# Altium project ESP32_P4_ESP32_C5.PrjPcb
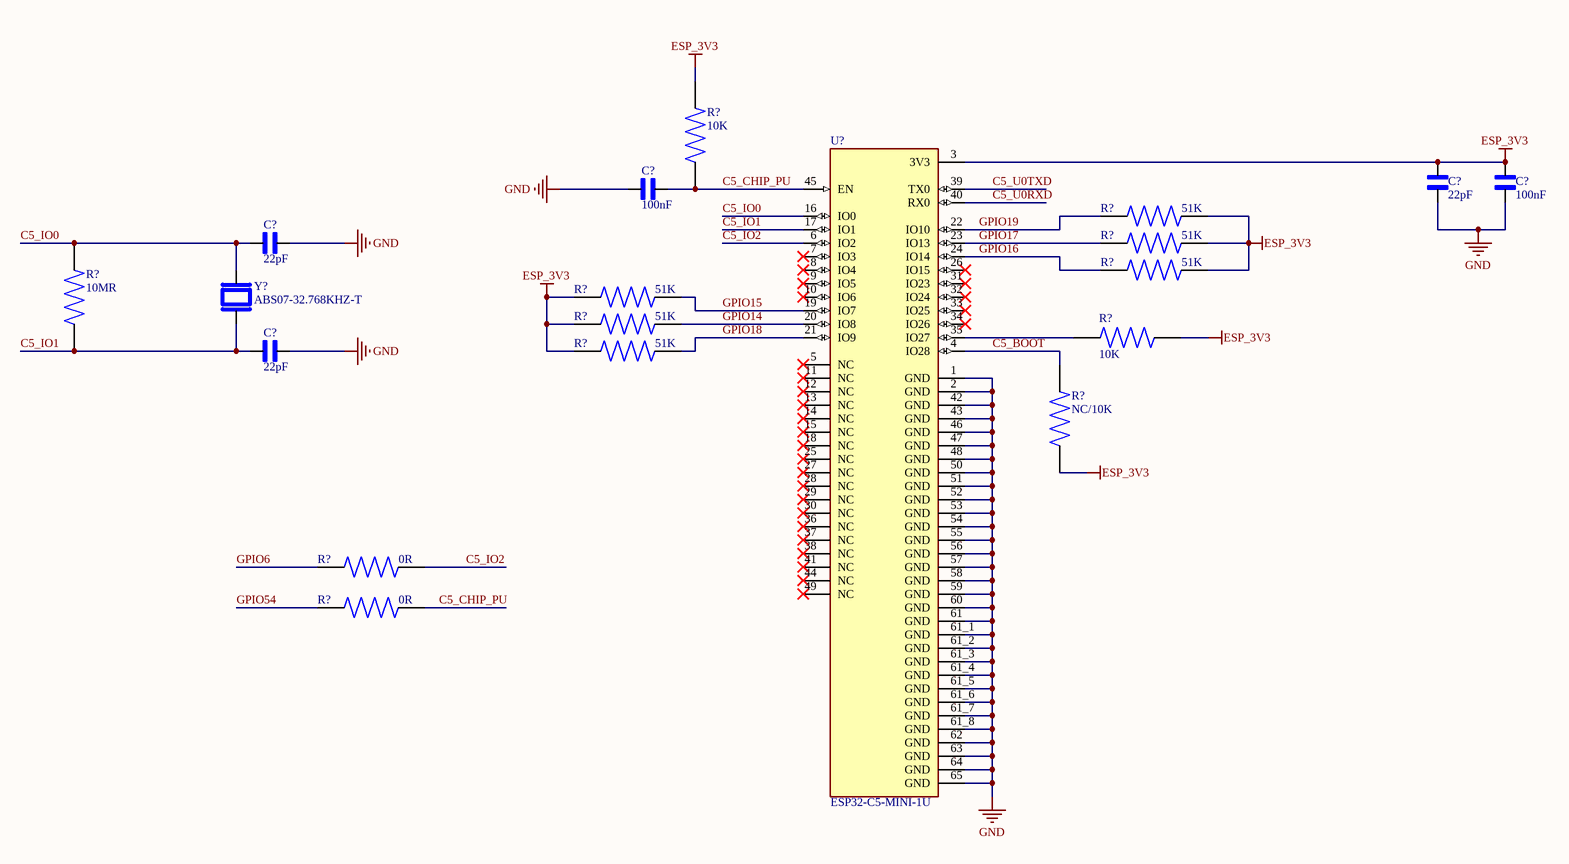
[diagram p0: esp32c5.SchDoc]
7 sheets, 178 parts. Net scope: global (net labels, ports and power ports of the same name join across sheets).
Sheets:
  esp32c5.SchDoc
  MSD_CARD.SchDoc
  type_C_A_power.SchDoc
  usb_uart_ESP32P4.SchDoc
  ESP32_P4.SchDoc
  connect.SchDoc
  usb_uart_esp32c5.SchDoc

## Sheet esp32c5.SchDoc
size B; SheetNumber: 1; SheetTotal: 5

### Parts
(Parts that share a designator on the sheet are numbered #1, #2 ... from top to bottom, then left to right.)
C?#1  100nF  [CAPC1005X61N]
C?#2  22pF  [CAPC1005X61N]
C?#3  100nF  [CAPC1005X61N]
C?#4  22pF  [CAPC1005X61N]
C?#5  22pF  [CAPC1005X61N]
R?#1  10K  [RES_ERJU02F5102X]
R?#2  51K  [RES_ERJU02F5102X]
R?#3  51K  [RES_ERJU02F5102X]
R?#4  51K  [RES_ERJU02F5102X]
R?#5  10MR  [RES_ERJU02F5102X]
R?#6  51K  [RES_ERJU02F5102X]
R?#7  51K  [RES_ERJU02F5102X]
R?#8  10K  [RES_ERJU02F5102X]
R?#9  51K  [RES_ERJU02F5102X]
R?#10  NC/10K  [RES_ERJU02F5102X]
R?#11  0R  [RES_ERJU02F5102X]
R?#12  0R  [RES_ERJU02F5102X]
U?#1  ESP32-C5-MINI-1U  [ESP32-C5-MINI-1U]
Y?#1  ABS07-32.768KHZ-T  [XTAL_ABS07-32.768KHZ-T]

### Nets
ESP_3V3: C?#2.2 C?#3.2 R?#1.1 R?#2.2 R?#3.2 R?#4.2 R?#6.1 R?#7.1 R?#8.1 R?#9.1 R?#10.2 U?#1.3(3V3)
GND: C?#1.2 C?#2.1 C?#3.1 C?#4.2 C?#5.2 U?#1.1(GND) U?#1.2(GND) U?#1.42(GND) U?#1.43(GND) U?#1.46(GND) U?#1.47(GND) U?#1.48(GND) U?#1.50(GND) U?#1.51(GND) U?#1.52(GND) U?#1.53(GND) U?#1.54(GND) U?#1.55(GND) U?#1.56(GND) U?#1.57(GND) U?#1.58(GND) U?#1.59(GND) U?#1.60(GND) U?#1.61(GND) U?#1.61_1(GND) U?#1.61_2(GND) U?#1.61_3(GND) U?#1.61_4(GND) U?#1.61_5(GND) U?#1.61_6(GND) U?#1.61_7(GND) U?#1.61_8(GND) U?#1.62(GND) U?#1.63(GND) U?#1.64(GND) U?#1.65(GND)
C5_BOOT: R?#10.1 U?#1.4(IO28)
C5_CHIP_PU: C?#1.1 R?#1.2 R?#12.2 U?#1.45(EN)
C5_IO0: C?#4.1 R?#5.2 U?#1.16(IO0) Y?#1.2
C5_IO1: C?#5.1 R?#5.1 U?#1.17(IO1) Y?#1.1
C5_IO2: R?#11.2 U?#1.6(IO2)
C5_U0RXD: U?#1.40(RX0)
C5_U0TXD: U?#1.39(TX0)
GPIO6: R?#11.1
GPIO14: R?#7.2 U?#1.20(IO8)
GPIO15: R?#6.2 U?#1.19(IO7)
GPIO16: R?#4.1 U?#1.24(IO14)
GPIO17: R?#3.1 U?#1.23(IO13)
GPIO18: R?#9.2 U?#1.21(IO9)
GPIO19: R?#2.1 U?#1.22(IO10)
GPIO54: R?#12.1
NetR?#8_2: R?#8.2 U?#1.35(IO27)

Not connected (* = marked no-connect by the designer): U?#1 5(NC)* 7(IO3)* 8(IO4)* 9(IO5)* 10(IO6)* 11(NC)* 12(NC)* 13(NC)* 14(NC)* 15(NC)* 18(NC)* 25(NC)* 26(IO15)* 27(NC)* 28(NC)* 29(NC)* 30(NC)* 31(IO23)* 32(IO24)* 33(IO25)* 34(IO26)* 36(NC)* 37(NC)* 38(NC)* 41(NC)* 44(NC)* 49(NC)*

### Library data of the parts
C?#1-C?#5 = cap_0402_VJ0402D100MXCAP: cap 0402; MF: Vishay Vitramon; SnapEDA_Link: https://www.snapeda.com/parts/VJ0402D100MXCAP/Vishay/view-part/?ref=snap; Package: 1005 Vishay Vitramon; Value: *; MP: VJ0402D100MXCAP; Check_prices: https://www.snapeda.com/parts/VJ0402D100MXCAP/Vishay/view-part/?ref=eda
R?#1-R?#12 = res_0402_ERJU02F5102X: Availability: Unavailable; MP: ERJU02F5102X; Price: None; Package: None; Value: *
U?#1 = ESP32-C5-MINI-1U: Compact Wi-Fi 6 and Bluetooth 5.0 LE wireless module based on the ESP32-C5 SoC, featuring a 32-bit RISC-V single-core processor up to 240 MHz, 4 MB SPI flash, 2.4 GHz and 5 GHz dual-band Wi-Fi, IEEE 802.15.4 (Thread/Zigbee), and an external antenna connector (U.FL/IPEX). Integrated GPIO, SPI, UART, I2C, ADC, PWM and other peripherals. Designed for IoT, wireless communication, smart devices and embedded applications.
Y?#1 = ABS07-32.768KHZ-T: 32.768 kHz Â±20ppm Crystal 12.5pF 70 kOhms 2-SMD, No Lead; MF: Abracon; Availability: In Stock; SnapEDA_Link: https://www.snapeda.com/parts/ABS07-32.768KHZ-T/Abracon+LLC/view-part/?ref=snap; MP: ABS07-32.768KHZ-T; Price: None; Value: *; Check_prices: https://www.snapeda.com/parts/ABS07-32.768KHZ-T/Abracon+LLC/view-part/?ref=eda; Purchase-URL: https://pricing.snapeda.com/search/part/ABS07-32.768KHZ-T/?ref=eda; Package: SMD-2 Abracon LLC

## Sheet MSD_CARD.SchDoc
size A; SheetNumber: 2; SheetTotal: 5
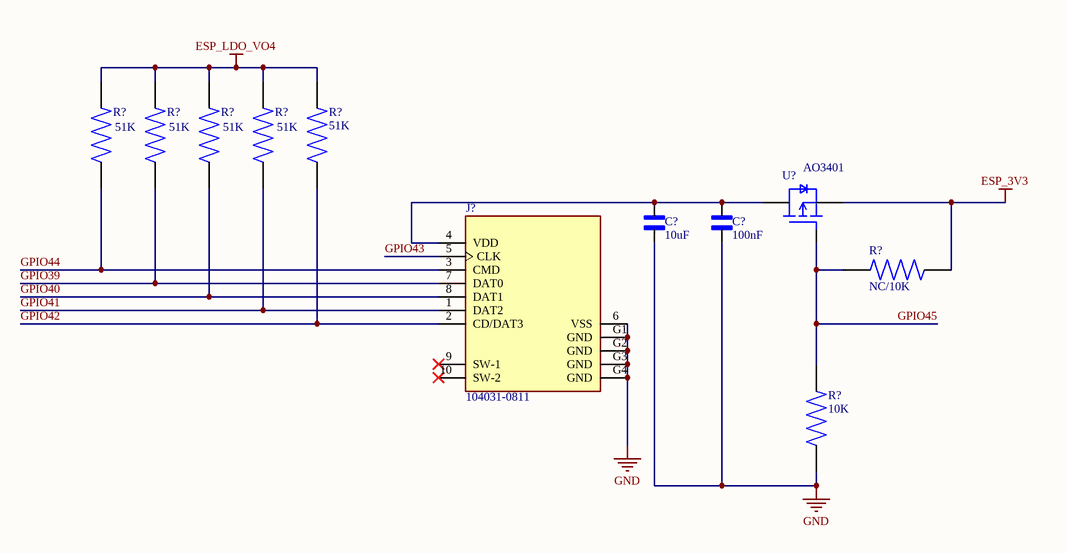
[diagram p1: MSD_CARD.SchDoc]

### Parts
(Parts that share a designator on the sheet are numbered #1, #2 ... from top to bottom, then left to right.)
C?#6  10uF  [CAPC1005X61N]
C?#7  100nF  [CAPC1005X61N]
J?#1  104031-0811  [MOLEX_104031-0811]
R?#13  51K  [RES_ERJU02F5102X]
R?#14  51K  [RES_ERJU02F5102X]
R?#15  51K  [RES_ERJU02F5102X]
R?#16  51K  [RES_ERJU02F5102X]
R?#17  51K  [RES_ERJU02F5102X]
R?#18  NC/10K  [RES_ERJU02F5102X]
R?#19  10K  [RES_ERJU02F5102X]
U?#2  AO3401  [SOT23-3]

### Nets
ESP_3V3: R?#18.1 U?#2.2(S)
ESP_LDO_VO4: R?#13.2 R?#14.2 R?#15.2 R?#16.2 R?#17.2
GND: C?#6.1 C?#7.1 J?#1.6(VSS) J?#1.G1(GND) J?#1.G2(GND) J?#1.G3(GND) J?#1.G4(GND) R?#19.1
GPIO39: J?#1.7(DAT0) R?#14.1
GPIO40: J?#1.8(DAT1) R?#15.1
GPIO41: J?#1.1(DAT2) R?#16.1
GPIO42: J?#1.2(CD/DAT3) R?#17.1
GPIO43: J?#1.5(CLK)
GPIO44: J?#1.3(CMD) R?#13.1
GPIO45: R?#18.2 R?#19.2 U?#2.1(G)
NetC?#6_2: C?#6.2 C?#7.2 J?#1.4(VDD) U?#2.3(D)

Not connected (* = marked no-connect by the designer): J?#1 9(SW-1)* 10(SW-2)*

### Library data of the parts
C?#6 C?#7 = cap_0402_VJ0402D100MXCAP: cap 0402; MF: Vishay Vitramon; SnapEDA_Link: https://www.snapeda.com/parts/VJ0402D100MXCAP/Vishay/view-part/?ref=snap; Package: 1005 Vishay Vitramon; Value: *; MP: VJ0402D100MXCAP; Check_prices: https://www.snapeda.com/parts/VJ0402D100MXCAP/Vishay/view-part/?ref=eda
J?#1 = 104031-0811: Surface Mount Micro SD Card Connector, with Push In Termination | Molex Incorporated 104031-0811; SnapEDA_Link: https://www.snapeda.com/parts/104031-0811/Molex/view-part/?ref=snap; Package: None; Value: *; MF: Molex; MP: 104031-0811; Check_prices: https://www.snapeda.com/parts/104031-0811/Molex/view-part/?ref=eda
R?#13-R?#19 = res_0402_ERJU02F5102X: Availability: Unavailable; MP: ERJU02F5102X; Price: None; Package: None; Value: *
U?#2 = AO3401: P-Channel 30 V 4A (Ta) 1.4W (Ta) Surface Mount SOT-23-3; MF: Alpha & Omega Semiconductor; SnapEDA_Link: https://www.snapeda.com/parts/AO3401/Alpha/view-part/?ref=snap; Package: SOT-23-3 Alpha &amp; Omega Semiconductor; Value: *; MP: AO3401; Check_prices: https://www.snapeda.com/parts/AO3401/Alpha/view-part/?ref=eda

## Sheet type_C_A_power.SchDoc
size B; SheetNumber: 3; SheetTotal: 7
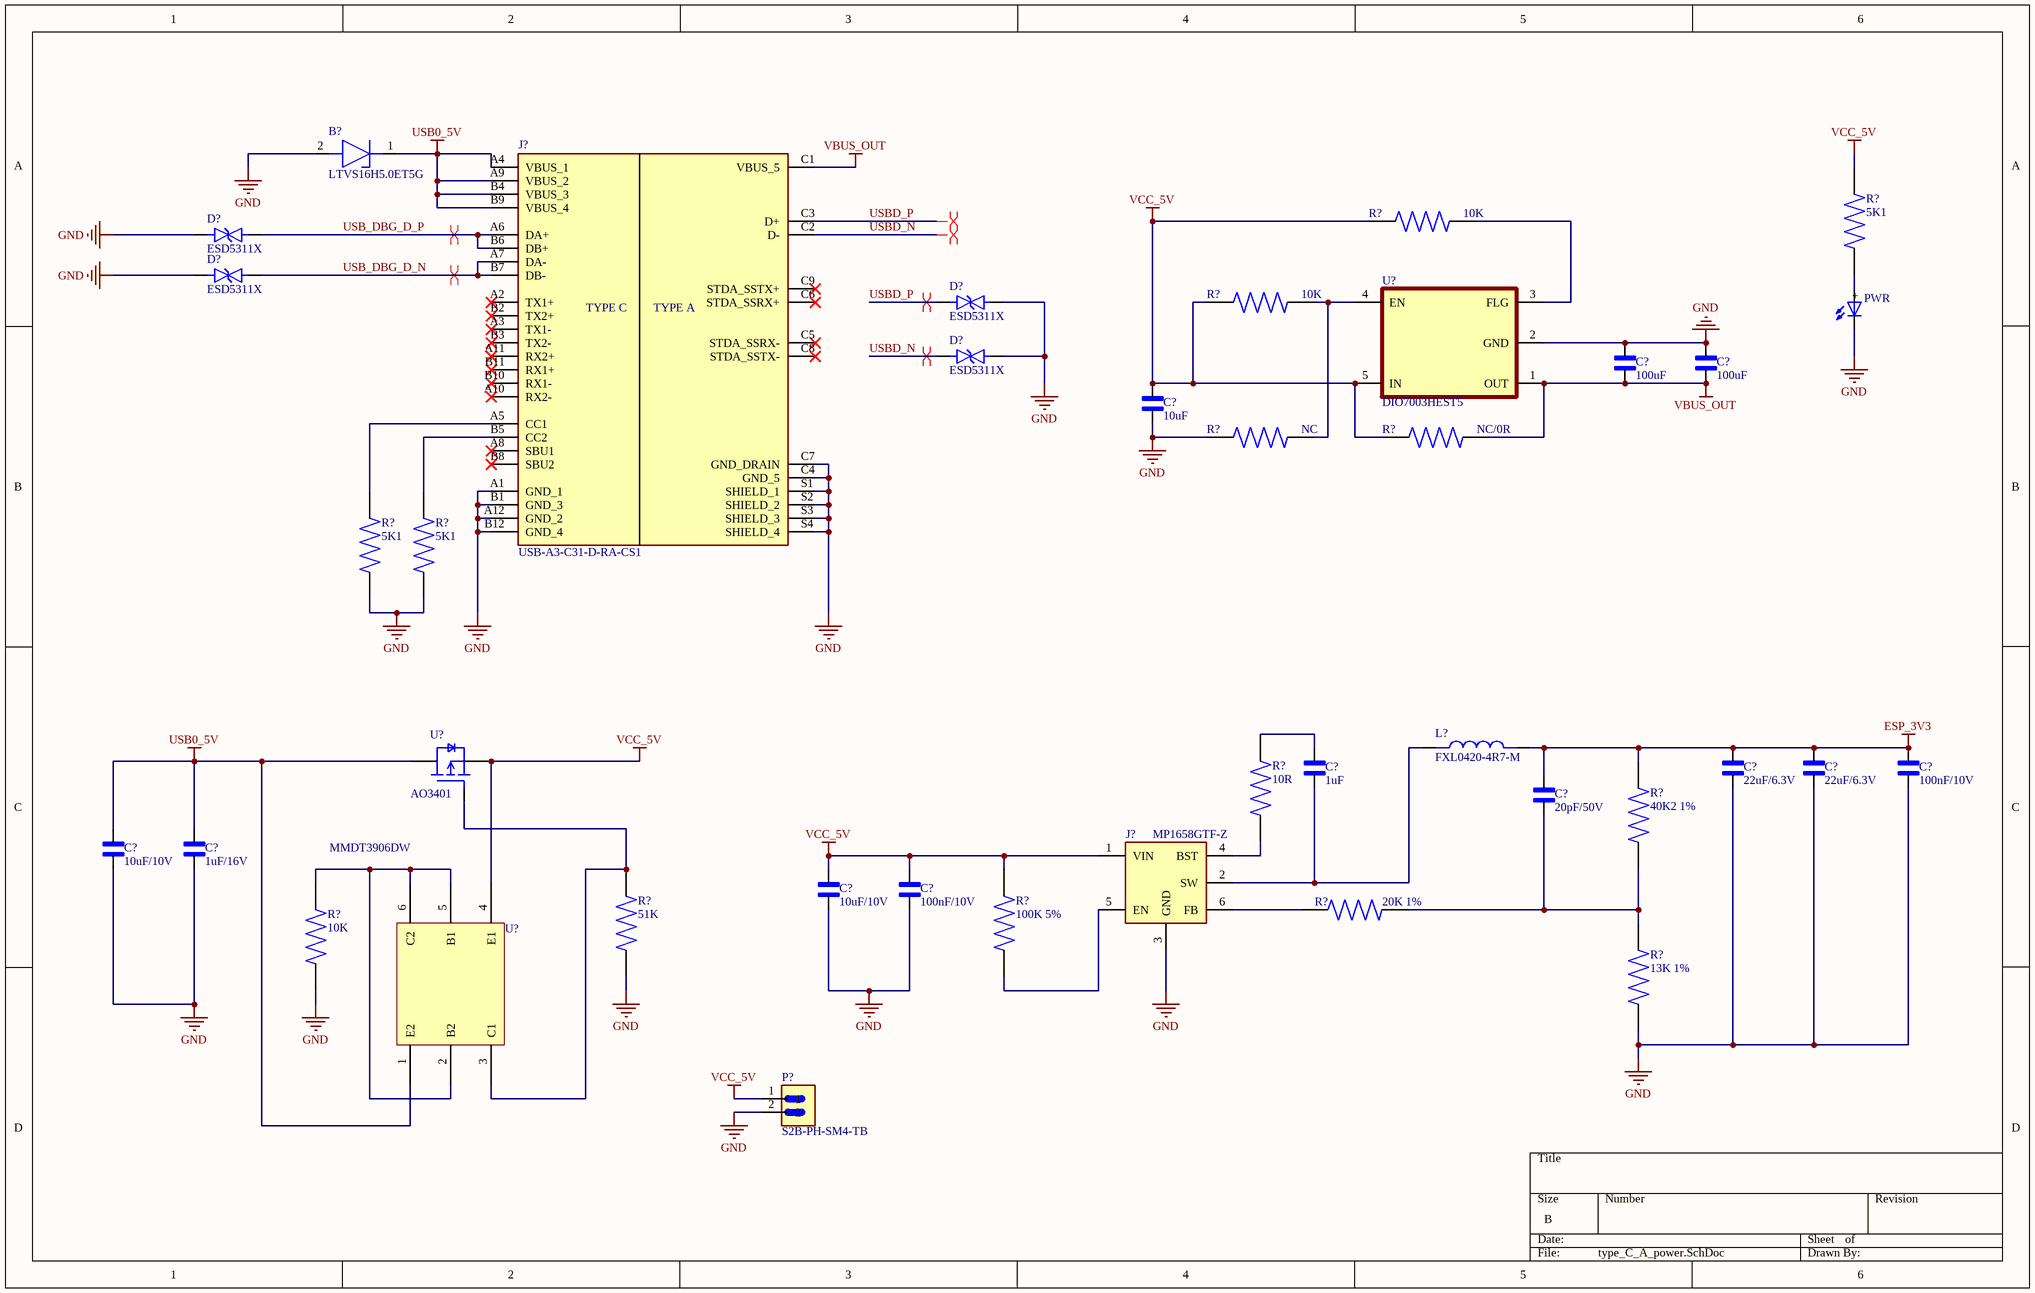
[diagram p2: type_C_A_power.SchDoc]

### Parts
(Parts that share a designator on the sheet are numbered #1, #2 ... from top to bottom, then left to right.)
B?#1  LTVS16H5.0ET5G  [LTVS16H50ET5G]
C?#8  100uF  [CAPC1005X61N]
C?#9  100uF  [CAPC1005X61N]
C?#10  10uF  [CAPC1005X61N]
C?#11  1uF  [CAPC1005X61N]
C?#12  22uF/6.3V  [CAPC1005X61N]
C?#13  22uF/6.3V  [CAPC1005X61N]
C?#14  100nF/10V  [CAPC1005X61N]
C?#15  20pF/50V  [CAPC1005X61N]
C?#16  10uF/10V  [CAPC1005X61N]
C?#17  1uF/16V  [CAPC1005X61N]
C?#18  10uF/10V  [CAPC1005X61N]
C?#19  100nF/10V  [CAPC1005X61N]
D?#1  ESD5311X  [DIO_PZU13B2L,315]
D?#2  ESD5311X  [DIO_PZU13B2L,315]
D?#3  ESD5311X  [DIO_PZU13B2L,315]
D?#4  ESD5311X  [DIO_PZU13B2L,315]
J?#2  USB-A3-C31-D-RA-CS1  [USBA3C31DRACS1]
J?#3  MP1658GTF-Z  [SOTFL50P160X60-6N]
L?#1  FXL0420-4R7-M  [FXL0420-XRX-M]
P?  S2B-PH-SM4-TB  [JST_S2B-PH-SM4-TB]
PWR  WL-SMCW_1206  [WL-SMCW_1206]  (value not drawn)
R?#20  10K  [RES_ERJU02F5102X]
R?#21  5K1  [RES_ERJU02F5102X]
R?#22  10K  [RES_ERJU02F5102X]
R?#23  NC  [RES_ERJU02F5102X]
R?#24  NC/0R  [RES_ERJU02F5102X]
R?#25  5K1  [RES_ERJU02F5102X]
R?#26  5K1  [RES_ERJU02F5102X]
R?#27  10R  [RES_ERJU02F5102X]
R?#28  40K2 1%  [RES_ERJU02F5102X]
R?#29  20K 1%  [RES_ERJU02F5102X]
R?#30  51K  [RES_ERJU02F5102X]
R?#31  100K 5%  [RES_ERJU02F5102X]
R?#32  10K  [RES_ERJU02F5102X]
R?#33  13K 1%  [RES_ERJU02F5102X]
U?#3  DIO7003HEST5  [SOT95P280X145-5N]
U?#4  AO3401  [SOT23-3]
U?#5  MMDT3906DW  [SOT65P230X120-6N]

### Nets
ESP_3V3: C?#12.2 C?#13.2 C?#14.2 C?#15.2 L?#1.2 R?#28.1
GND: B?#1.2(A) C?#8.2 C?#9.2 C?#10.1 C?#12.1 C?#13.1 C?#14.1 C?#16.1 C?#17.1 C?#18.1 C?#19.1 D?#1.1(K) D?#2.1(K) D?#3.2(A) D?#4.2(A) J?#2.A1(GND_1) J?#2.A12(GND_2) J?#2.B1(GND_3) J?#2.B12(GND_4) J?#2.C4(GND_5) J?#2.C7(GND_DRAIN) J?#2.S1(SHIELD_1) J?#2.S2(SHIELD_2) J?#2.S3(SHIELD_3) J?#2.S4(SHIELD_4) J?#3.3(GND) P?.2 PWR.1(NEG) R?#23.1 R?#25.1 R?#26.1 R?#30.1 R?#32.1 R?#33.2 U?#3.2(GND)
USB0_5V: B?#1.1(K) C?#16.2 C?#17.2 J?#2.A4(VBUS_1) J?#2.A9(VBUS_2) J?#2.B4(VBUS_3) J?#2.B9(VBUS_4) U?#4.3(D) U?#5.1(E2)
VBUS_OUT: C?#8.1 C?#9.1 J?#2.C1(VBUS_5) R?#24.2 U?#3.1(OUT)
VCC_5V: C?#10.2 C?#18.2 C?#19.2 J?#3.1(VIN) P?.1 R?#20.1 R?#21.2 R?#22.1 R?#24.1 R?#31.2 U?#3.5(IN) U?#4.2(S) U?#5.4(E1)
USB_DBG_D_N: D?#2.2(A) J?#2.A7(DA-) J?#2.B7(DB-)
USB_DBG_D_P: D?#1.2(A) J?#2.A6(DA+) J?#2.B6(DB+)
USBD_N: D?#4.1(K) J?#2.C2(D-)
USBD_P: D?#3.1(K) J?#2.C3(D+)
NetC?#11_1: C?#11.1 J?#3.2(SW) L?#1.1
NetC?#11_2: C?#11.2 R?#27.2
NetC?#15_1: C?#15.1 R?#28.2 R?#29.1 R?#33.1
NetJ?#2_A5: J?#2.A5(CC1) R?#25.2
NetJ?#2_B5: J?#2.B5(CC2) R?#26.2
NetJ?#3_4: J?#3.4(BST) R?#27.1
NetJ?#3_5: J?#3.5(EN) R?#31.1
NetJ?#3_6: J?#3.6(FB) R?#29.2
NetPWR_2: PWR.2(POS) R?#21.1
NetR?#20_2: R?#20.2 U?#3.3(FLG)
NetR?#22_2: R?#22.2 R?#23.2 U?#3.4(EN)
NetR?#30_2: R?#30.2 U?#4.1(G) U?#5.3(C1)
NetR?#32_2: R?#32.2 U?#5.2(B2) U?#5.5(B1) U?#5.6(C2)

Not connected (* = marked no-connect by the designer): J?#2 A2(TX1+)* A3(TX1-)* A8(SBU1)* A10(RX2-)* A11(RX2+)* B2(TX2+)* B3(TX2-)* B8(SBU2)* B10(RX1-)* B11(RX1+)* C5(STDA_SSRX-)* C6(STDA_SSRX+)* C8(STDA_SSTX-)* C9(STDA_SSTX+)*

### Layout directives
differential pair: USB_DBG_D_N, USB_DBG_D_P, USBD_N, USBD_P

### Notes on the sheet
- (in symbol USB-A3-C31-D-RA-CS1) TYPE C; TYPE A
- (in symbol WL-SMCW_1206) +

### Library data of the parts
B?#1 = LTVS16H5.0ET5G: DFN1610 ESD Protection Devices ROHS; Manufacturer_Name: LRC; Geometry.Height: 0.55mm; Manufacturer_Part_Number: LTVS16H5.0ET5G; Mouser Part Number: *; Mouser Price/Stock: *; Arrow Part Number: *; Arrow Price/Stock: *; Datasheet Link: https://www.alldatasheet.net/datasheet-pdf/pdf/1107931/LRC/LTVS16H5.0ET5G.html
C?#8-C?#19 = cap_0402_VJ0402D100MXCAP: cap 0402; MF: Vishay Vitramon; SnapEDA_Link: https://www.snapeda.com/parts/VJ0402D100MXCAP/Vishay/view-part/?ref=snap; Package: 1005 Vishay Vitramon; Value: *; MP: VJ0402D100MXCAP; Check_prices: https://www.snapeda.com/parts/VJ0402D100MXCAP/Vishay/view-part/?ref=eda
D?#1-D?#4 = ESD5311X: Bidirectional TVS ESD Protection Diode, 5V Working Voltage, Low Capacitance, 80W Peak Pulse Power, DFN1006-2 Package.; MF: Nexperia; MP: PZU13B2L,315; SnapEDA_Link: https://www.snapeda.com/parts/PZU13B2L,315/Nexperia/view-part/?ref=snap; Package: DFN1006-2-2 Nexperia USA Inc.; Value: *; Check_prices: https://www.snapeda.com/parts/PZU13B2L,315/Nexperia/view-part/?ref=eda
J?#2 = USB-A3-C31-D-RA-CS1: Connector, USB TYPE-A 3.0 over TYPE-C 3.1, right angle, PCB, terminals; Manufacturer_Name: Adam Tech; Geometry.Height: 15.91mm; Manufacturer_Part_Number: USB-A3-C31-D-RA-CS1; Mouser Part Number: 737-USBA3C31DRACS1; Mouser Price/Stock: https://www.mouser.co.uk/ProductDetail/Adam-Tech/USB-A3-C31-D-RA-CS1?qs=HoCaDK9Nz5e7qYzkfwPXcA%3D%3D; Arrow Part Number: USB-A3-C31-D-RA-CS1; Arrow Price/Stock: https://www.arrow.com/en/products/usb-a3-c31-d-ra-cs1/adam-tech.html?utm_currency=USD&region=nac; Datasheet Link: https://app.adam-tech.com/products/download/data_sheet/195873/usb-a3-c31-d-ra-cs1-data-sheet.pdf
J?#3 = MP1658GTF-Z: MF: MPS Industries, Inc.; SnapEDA_Link: https://www.snapeda.com/parts/MP1658GTF-Z/MPS/view-part/?ref=snap; Package: None; Value: *; MP: MP1658GTF-Z; Check_prices: https://www.snapeda.com/parts/MP1658GTF-Z/MPS/view-part/?ref=eda
L?#1 = FXL0420-XRX-M: 47uH 4.4x4.2x2 2.8A
P? = S2B-PH-SM4-TB: Connector Header Surface Mount, Right Angle 2 position 0.079 (2.00mm); MF: JST Sales; SnapEDA_Link: https://www.snapeda.com/parts/S2B-PH-SM4-TB/JST/view-part/?ref=snap; Package: None; Value: *; MP: S2B-PH-SM4-TB; Check_prices: https://www.snapeda.com/parts/S2B-PH-SM4-TB/JST/view-part/?ref=eda
PWR = WL-SMCW_1206: 1206, Blue Typ.(@20mA): 470nm, 145mcd, 3.2V, 140Â° InGaN; MF: Wurth Electronics; MP: 150120BS75000; SnapEDA_Link: https://www.snapeda.com/parts/150120BS75000/Wurth+Electronics/view-part/?ref=snap; Package: 1206 Wurth Electronics; Value: *; Check_prices: https://www.snapeda.com/parts/150120BS75000/Wurth+Electronics/view-part/?ref=eda
R?#20-R?#33 = res_0402_ERJU02F5102X: Availability: Unavailable; MP: ERJU02F5102X; Price: None; Package: None; Value: *
U?#3 = DIO7003HEST5: Low-loss 5.5V power distribution switch with 2A continuous output current, 2.5A current limit, active-high enable, overcurrent protection, short-circuit protection, thermal protection, reverse-current blocking, and undervoltage lockout. Package: SOT-23-5.; MF: Texas Instruments; MP: SN74LVC1G08DBVTE4; SnapEDA_Link: https://www.snapeda.com/parts/SN74LVC1G08DBVTE4/Texas+Instruments/view-part/?ref=snap; Package: SOT-23-5 Texas Instruments; Value: *; Check_prices: https://www.snapeda.com/parts/SN74LVC1G08DBVTE4/Texas+Instruments/view-part/?ref=eda
U?#4 = AO3401: as U?#2 on sheet MSD_CARD; SnapEDA_Link: https://www.snapeda.com/parts/AO3401/Alpha/view-part/?ref=snap; Package: SOT-23-3 Alpha &amp; Omega Semiconductor; Value: *; MP: AO3401; Check_prices: https://www.snapeda.com/parts/AO3401/Alpha/view-part/?ref=eda
U?#5 = MMDT3906DW: Bipolar (BJT) Transistor PNP 40 V 0.2 A 250MHz 200 mW Surface Mount SOT-363

## Sheet usb_uart_ESP32P4.SchDoc
size A; SheetNumber: 4; SheetTotal: 7
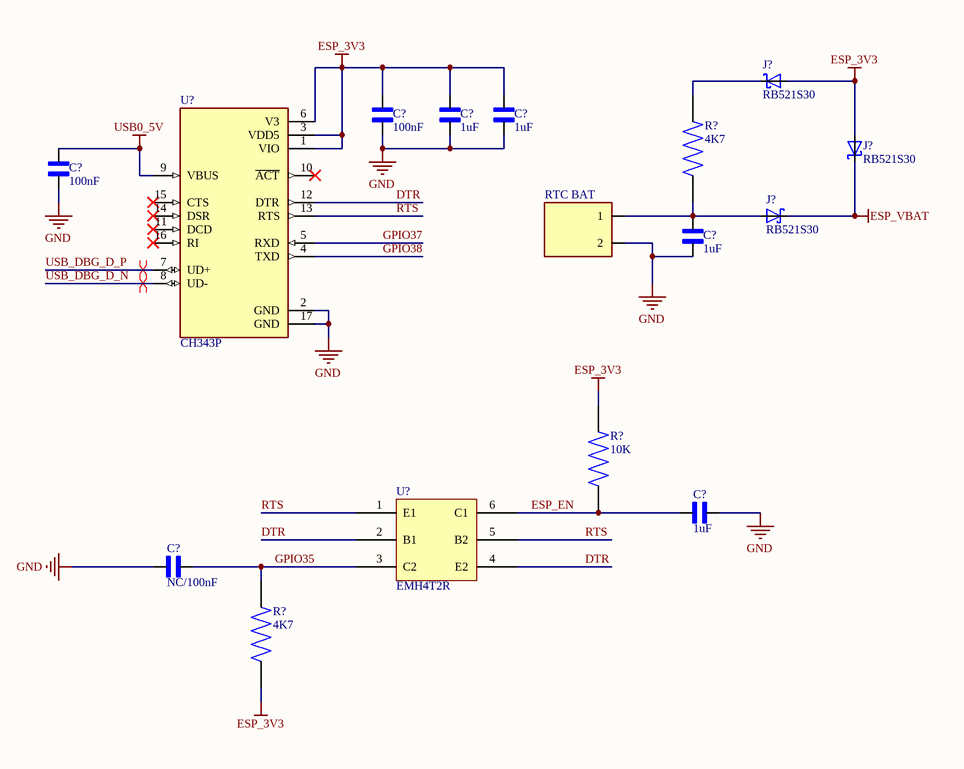
[diagram p3: usb_uart_ESP32P4.SchDoc]

### Parts
(Parts that share a designator on the sheet are numbered #1, #2 ... from top to bottom, then left to right.)
C?#20  100nF  [CAPC1005X61N]
C?#21  1uF  [CAPC1005X61N]
C?#22  1uF  [CAPC1005X61N]
C?#23  100nF  [CAPC1005X61N]
C?#24  1uF  [CAPC1005X61N]
C?#25  1uF  [CAPC1005X61N]
C?#26  NC/100nF  [CAPC1005X61N]
J?#4  RB521S30  [SOD523]
J?#5  RB521S30  [SOD523]
J?#6  RB521S30  [SOD523]
R?#34  4K7  [RES_ERJU02F5102X]
R?#35  10K  [RES_ERJU02F5102X]
R?#36  4K7  [RES_ERJU02F5102X]
RTC_BAT  B2B-PH-SM4-TB(LF)(SN)  [SM4-CON]  (value not drawn)
U?#6  CH343P  [QFN50P300X300X80-17N]
U?#7  EMH4T2R  [SOT50P160X55-6N]

### Nets
ESP_3V3: C?#20.2 C?#21.2 C?#22.2 J?#4.2(A) J?#5.2(A) R?#35.2 R?#36.1 U?#6.1(VIO) U?#6.3(VDD5) U?#6.6(V3)
ESP_VBAT: J?#5.1(K) J?#6.1(K)
GND: C?#20.1 C?#21.1 C?#22.1 C?#23.1 C?#24.1 C?#25.1 C?#26.2 RTC_BAT.2 U?#6.2(GND) U?#6.17(GND)
USB0_5V: C?#23.2 U?#6.9(VBUS)
DTR: U?#6.12(DTR) U?#7.2(B1) U?#7.4(E2)
ESP_EN: C?#25.2 R?#35.1 U?#7.6(C1)
GPIO35: C?#26.1 R?#36.2 U?#7.3(C2)
GPIO37: U?#6.5(RXD)
GPIO38: U?#6.4(TXD)
RTS: U?#6.13(RTS) U?#7.1(E1) U?#7.5(B2)
USB_DBG_D_N: U?#6.8(UD-)
USB_DBG_D_P: U?#6.7(UD+)
NetC?#24_2: C?#24.2 J?#6.2(A) R?#34.1 RTC_BAT.1
NetJ?#4_1: J?#4.1(K) R?#34.2

Not connected (* = marked no-connect by the designer): U?#6 10(~{ACT})* 11(DCD)* 14(DSR)* 15(CTS)* 16(RI)*

### Layout directives
differential pair: USB_DBG_D_N, USB_DBG_D_P

### Library data of the parts
C?#20-C?#26 = cap_0402_VJ0402D100MXCAP: cap 0402; MF: Vishay Vitramon; SnapEDA_Link: https://www.snapeda.com/parts/VJ0402D100MXCAP/Vishay/view-part/?ref=snap; Package: 1005 Vishay Vitramon; Value: *; MP: VJ0402D100MXCAP; Check_prices: https://www.snapeda.com/parts/VJ0402D100MXCAP/Vishay/view-part/?ref=eda
J?#4-J?#6 = RB521S30: Diode 30 V 200mA Surface Mount SOD-523F; MF: Taiwan Semiconductor; MP: RB521S-30; SnapEDA_Link: https://www.snapeda.com/parts/RB521S-30/taiwan/view-part/?ref=snap; Package: SOD-523F-2 Taiwan Semiconductor; Value: *; Check_prices: https://www.snapeda.com/parts/RB521S-30/taiwan/view-part/?ref=eda
R?#34-R?#36 = res_0402_ERJU02F5102X: Availability: Unavailable; MP: ERJU02F5102X; Price: None; Package: None; Value: *
RTC_BAT = B2B-PH-SM4-TB(LF)(SN): Connector Header Surface Mount 2 position 0.079 (2.00mm); MF: JST Sales; SnapEDA_Link: https://www.snapeda.com/parts/B2B-PH-SM4-TB(LF)(SN)/JST+Sales+America+Inc./view-part/?ref=snap; Package: NON STANDARD-2 JST; Value: *; MP: B2B-PH-SM4-TB(LF)(SN); Check_prices: https://www.snapeda.com/parts/B2B-PH-SM4-TB(LF)(SN)/JST+Sales+America+Inc./view-part/?ref=eda
U?#6 = CH343P: USB to High-Speed Serial Chip CH343; MF: WCH; SnapEDA_Link: https://www.snapeda.com/parts/CH343P/WCH/view-part/?ref=snap; Package: Package; Value: *; MP: CH343P; Check_prices: https://www.snapeda.com/parts/CH343P/WCH/view-part/?ref=eda
U?#7 = EMH4T2R: Dual NPN digital transistor with built-in bias resistors, 50V, 100mA, SOT-563 (EMT6) package.

## Sheet ESP32_P4.SchDoc
size D; SheetNumber: 5; SheetTotal: 6
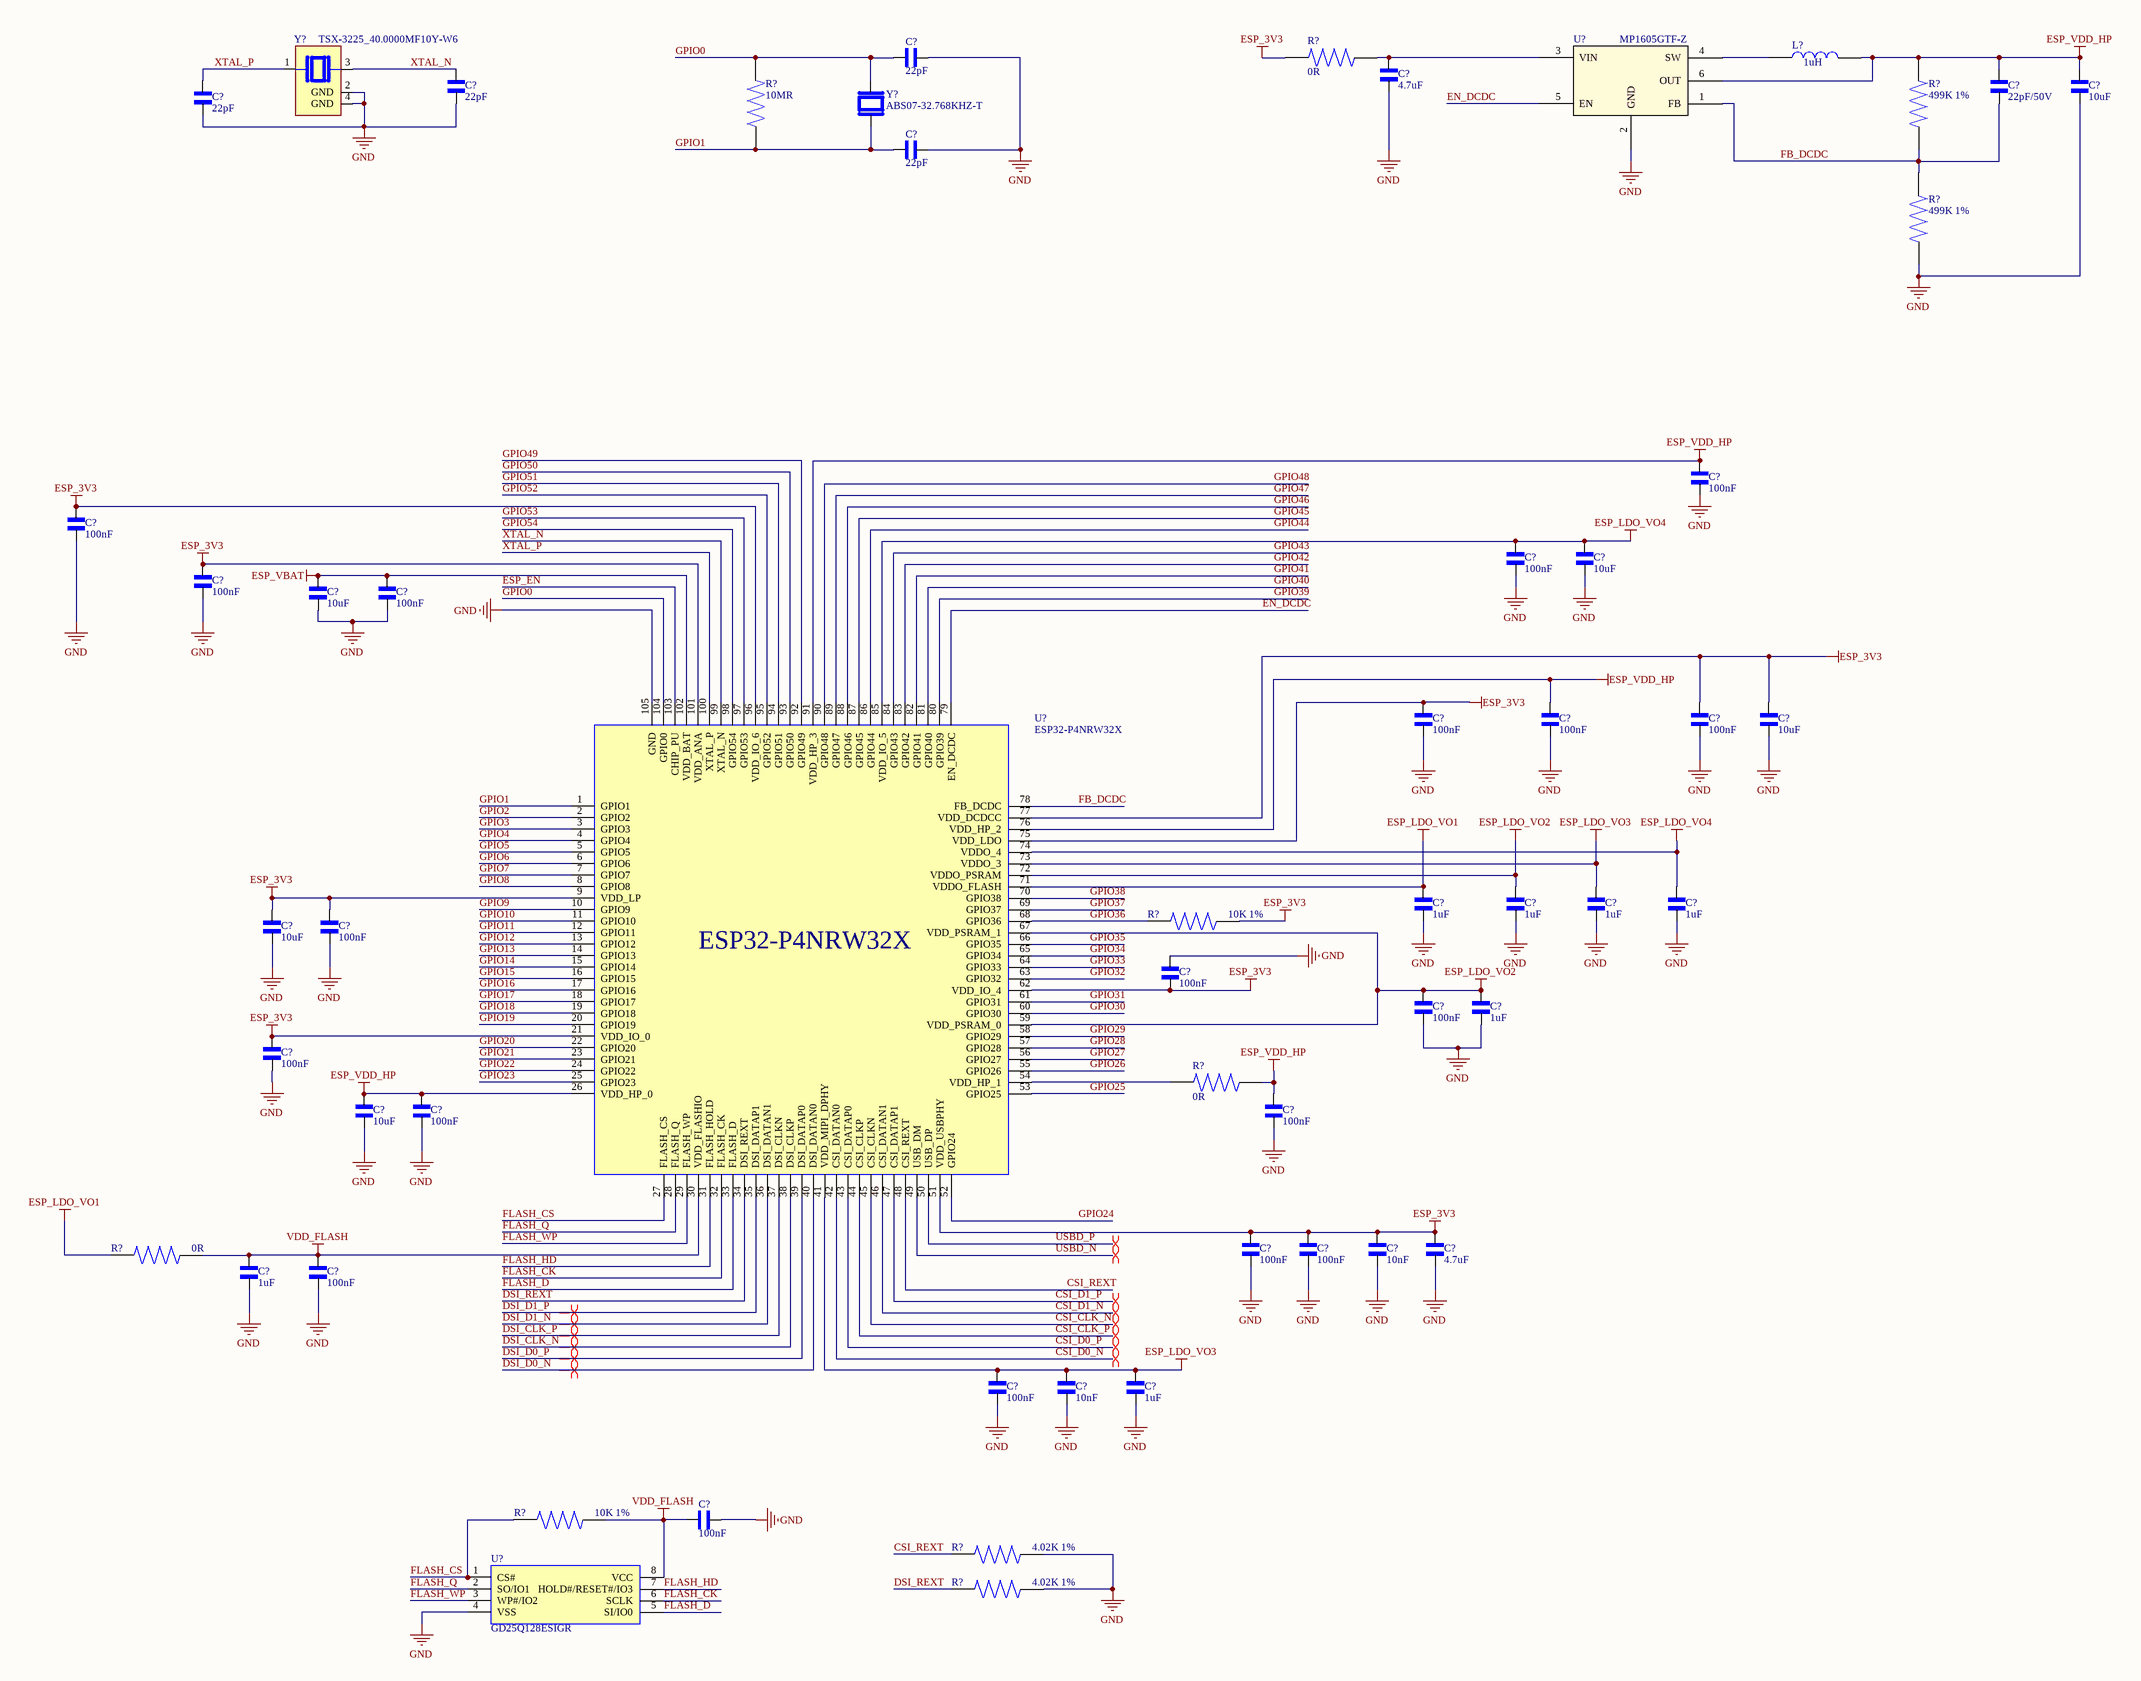
[diagram p4: ESP32_P4.SchDoc]

### Parts
(Parts that share a designator on the sheet are numbered #1, #2 ... from top to bottom, then left to right.)
C?#27  22pF  [CAPC1005X61N]
C?#28  4.7uF  [CAPC1005X61N]
C?#29  22pF/50V  [CAPC1005X61N]
C?#30  10uF  [CAPC1005X61N]
C?#31  22pF  [CAPC1005X61N]
C?#32  22pF  [CAPC1005X61N]
C?#33  22pF  [CAPC1005X61N]
C?#34  100nF  [CAPC1005X61N]
C?#35  100nF  [CAPC1005X61N]
C?#36  100nF  [CAPC1005X61N]
C?#37  10uF  [CAPC1005X61N]
C?#38  100nF  [CAPC1005X61N]
C?#39  10uF  [CAPC1005X61N]
C?#40  100nF  [CAPC1005X61N]
C?#41  100nF  [CAPC1005X61N]
C?#42  100nF  [CAPC1005X61N]
C?#43  100nF  [CAPC1005X61N]
C?#44  10uF  [CAPC1005X61N]
C?#45  1uF  [CAPC1005X61N]
C?#46  1uF  [CAPC1005X61N]
C?#47  1uF  [CAPC1005X61N]
C?#48  1uF  [CAPC1005X61N]
C?#49  10uF  [CAPC1005X61N]
C?#50  100nF  [CAPC1005X61N]
C?#51  100nF  [CAPC1005X61N]
C?#52  100nF  [CAPC1005X61N]
C?#53  1uF  [CAPC1005X61N]
C?#54  100nF  [CAPC1005X61N]
C?#55  10uF  [CAPC1005X61N]
C?#56  100nF  [CAPC1005X61N]
C?#57  100nF  [CAPC1005X61N]
C?#58  100nF  [CAPC1005X61N]
C?#59  100nF  [CAPC1005X61N]
C?#60  10nF  [CAPC1005X61N]
C?#61  4.7uF  [CAPC1005X61N]
C?#62  1uF  [CAPC1005X61N]
C?#63  100nF  [CAPC1005X61N]
C?#64  100nF  [CAPC1005X61N]
C?#65  10nF  [CAPC1005X61N]
C?#66  1uF  [CAPC1005X61N]
C?#67  100nF  [CAPC1005X61N]
L?#2  1uH  [INDC2016X100N]
R?#37  0R  [RES_ERJU02F5102X]
R?#38  10MR  [RES_ERJU02F5102X]
R?#39  499K 1%  [RES_ERJU02F5102X]
R?#40  499K 1%  [RES_ERJU02F5102X]
R?#41  10K 1%  [RES_ERJU02F5102X]
R?#42  0R  [RES_ERJU02F5102X]
R?#43  0R  [RES_ERJU02F5102X]
R?#44  10K 1%  [RES_ERJU02F5102X]
R?#45  4.02K 1%  [RES_ERJU02F5102X]
R?#46  4.02K 1%  [RES_ERJU02F5102X]
U?#8  MP1605GTF-Z  [SOT563_MP1605_MNP]
U?#9  ESP32-P4NRW32X  [ESP32-P4]
U?#10  GD25Q128ESIGR  [SOIC-8_3.9x4.9mm_P1.27mm]
Y?#2  TSX-3225_40.0000MF10Y-W6  [XTAL_TSX-3225_40.0000MF10Y-W6]
Y?#3  ABS07-32.768KHZ-T  [XTAL_ABS07-32.768KHZ-T]

### Nets
ESP_3V3: C?#35.1 C?#38.1 C?#41.1 C?#43.1 C?#44.1 C?#49.1 C?#50.1 C?#51.1 C?#54.1 C?#58.1 C?#59.1 C?#60.1 C?#61.1 R?#37.2 R?#41.1 U?#9.9(VDD_LP) U?#9.21(VDD_IO_0) U?#9.51(VDD_USBPHY) U?#9.62(VDD_IO_4) U?#9.75(VDD_LDO) U?#9.77(VDD_DCDCC) U?#9.96(VDD_IO_6) U?#9.101(VDD_ANA)
ESP_LDO_VO1: C?#45.1 R?#43.2 U?#9.71(VDDO_FLASH)
ESP_LDO_VO2: C?#46.1 C?#52.1 C?#53.1 U?#9.59(VDD_PSRAM_0) U?#9.67(VDD_PSRAM_1) U?#9.72(VDDO_PSRAM)
ESP_LDO_VO3: C?#47.1 C?#64.1 C?#65.1 C?#66.1 U?#9.41(VDD_MIPI_DPHY) U?#9.73(VDDO_3)
ESP_LDO_VO4: C?#36.1 C?#37.1 C?#48.1 U?#9.74(VDDO_4) U?#9.85(VDD_IO_5)
ESP_VBAT: C?#39.1 C?#40.1 U?#9.102(VDD_BAT)
ESP_VDD_HP: C?#29.1 C?#30.1 C?#34.1 C?#42.1 C?#55.1 C?#56.1 C?#57.1 L?#2.2 R?#39.1 R?#42.1 U?#8.6(OUT) U?#9.26(VDD_HP_0) U?#9.76(VDD_HP_2) U?#9.91(VDD_HP_3)
GND: C?#27.1 C?#28.2 C?#30.2 C?#31.1 C?#32.1 C?#33.1 C?#34.2 C?#35.2 C?#36.2 C?#37.2 C?#38.2 C?#39.2 C?#40.2 C?#41.2 C?#42.2 C?#43.2 C?#44.2 C?#45.2 C?#46.2 C?#47.2 C?#48.2 C?#49.2 C?#50.2 C?#51.2 C?#52.2 C?#53.2 C?#54.2 C?#55.2 C?#56.2 C?#57.2 C?#58.2 C?#59.2 C?#60.2 C?#61.2 C?#62.2 C?#63.2 C?#64.2 C?#65.2 C?#66.2 C?#67.2 R?#40.2 R?#45.1 R?#46.1 U?#8.2(GND) U?#9.105(GND) U?#10.4(VSS) Y?#2.2(GND) Y?#2.4(GND)
VDD_FLASH: C?#62.1 C?#63.1 C?#67.1 R?#43.1 R?#44.1 U?#9.30(VDD_FLASHIO) U?#10.8(VCC)
CSI_CLK_N: U?#9.45(CSI_CLKN)
CSI_CLK_P: U?#9.44(CSI_CLKP)
CSI_D0_N: U?#9.42(CSI_DATAN0)
CSI_D0_P: U?#9.43(CSI_DATAP0)
CSI_D1_N: U?#9.46(CSI_DATAN1)
CSI_D1_P: U?#9.47(CSI_DATAP1)
CSI_REXT: R?#45.2 U?#9.48(CSI_REXT)
DSI_CLK_N: U?#9.38(DSI_CLKP)
DSI_CLK_P: U?#9.37(DSI_CLKN)
DSI_D0_N: U?#9.40(DSI_DATAN0)
DSI_D0_P: U?#9.39(DSI_DATAP0)
DSI_D1_N: U?#9.36(DSI_DATAN1)
DSI_D1_P: U?#9.35(DSI_DATAP1)
DSI_REXT: R?#46.2 U?#9.34(DSI_REXT)
EN_DCDC: U?#8.5(EN) U?#9.79(EN_DCDC)
ESP_EN: U?#9.103(CHIP_PU)
FB_DCDC: C?#29.2 R?#39.2 R?#40.1 U?#8.1(FB) U?#9.78(FB_DCDC)
FLASH_CK: U?#9.32(FLASH_CK) U?#10.6(SCLK)
FLASH_CS: R?#44.2 U?#9.27(FLASH_CS) U?#10.1(CS#)
FLASH_D: U?#9.33(FLASH_D) U?#10.5(SI/IO0)
FLASH_HD: U?#9.31(FLASH_HOLD) U?#10.7(HOLD#/RESET#/IO3)
FLASH_Q: U?#9.28(FLASH_Q) U?#10.2(SO/IO1)
FLASH_WP: U?#9.29(FLASH_WP) U?#10.3(WP#/IO2)
GPIO0: C?#27.2 R?#38.2 U?#9.104(GPIO0) Y?#3.2
GPIO1: C?#33.2 R?#38.1 U?#9.1(GPIO1) Y?#3.1
GPIO2: U?#9.2(GPIO2)
GPIO3: U?#9.3(GPIO3)
GPIO4: U?#9.4(GPIO4)
GPIO5: U?#9.5(GPIO5)
GPIO6: U?#9.6(GPIO6)
GPIO7: U?#9.7(GPIO7)  [project net ESP_I2C_SCL]
GPIO8: U?#9.8(GPIO8)  [project net ESP_I2C_SDA]
GPIO9: U?#9.10(GPIO9)
GPIO10: U?#9.11(GPIO10)
GPIO11: U?#9.12(GPIO11)
GPIO12: U?#9.13(GPIO12)
GPIO13: U?#9.14(GPIO13)
GPIO14: U?#9.15(GPIO14)
GPIO15: U?#9.16(GPIO15)
GPIO16: U?#9.17(GPIO16)
GPIO17: U?#9.18(GPIO17)
GPIO18: U?#9.19(GPIO18)
GPIO19: U?#9.20(GPIO19)
GPIO20: U?#9.22(GPIO20)
GPIO21: U?#9.23(GPIO21)
GPIO22: U?#9.24(GPIO22)
GPIO23: U?#9.25(GPIO23)
GPIO24: U?#9.52(GPIO24)
GPIO25: U?#9.53(GPIO25)
GPIO26: U?#9.55(GPIO26)
GPIO27: U?#9.56(GPIO27)
GPIO28: U?#9.57(GPIO28)
GPIO29: U?#9.58(GPIO29)
GPIO30: U?#9.60(GPIO30)
GPIO31: U?#9.61(GPIO31)
GPIO32: U?#9.63(GPIO32)
GPIO33: U?#9.64(GPIO33)
GPIO34: U?#9.65(GPIO34)
GPIO35: U?#9.66(GPIO35)
GPIO36: R?#41.2 U?#9.68(GPIO36)
GPIO37: U?#9.69(GPIO37)
GPIO38: U?#9.70(GPIO38)
GPIO39: U?#9.80(GPIO39)
GPIO40: U?#9.81(GPIO40)
GPIO41: U?#9.82(GPIO41)
GPIO42: U?#9.83(GPIO42)
GPIO43: U?#9.84(GPIO43)
GPIO44: U?#9.86(GPIO44)
GPIO45: U?#9.87(GPIO45)
GPIO46: U?#9.88(GPIO46)
GPIO47: U?#9.89(GPIO47)
GPIO48: U?#9.90(GPIO48)
GPIO49: U?#9.92(GPIO49)
GPIO50: U?#9.93(GPIO50)
GPIO51: U?#9.94(GPIO51)
GPIO52: U?#9.95(GPIO52)
GPIO53: U?#9.97(GPIO53)
GPIO54: U?#9.98(GPIO54)
USBD_N: U?#9.49(USB_DM)
USBD_P: U?#9.50(USB_DP)
XTAL_N: C?#31.2 U?#9.99(XTAL_N) Y?#2.3
XTAL_P: C?#32.2 U?#9.100(XTAL_P) Y?#2.1
NetC?#28_1: C?#28.1 R?#37.1 U?#8.3(VIN)
NetL?#2_1: L?#2.1 U?#8.4(SW)
NetR?#42_2: R?#42.2 U?#9.54(VDD_HP_1)

### Layout directives
differential pair: CSI_CLK_N, CSI_CLK_P, CSI_D0_N, CSI_D0_P, CSI_D1_N, CSI_D1_P, DSI_CLK_N, DSI_CLK_P, DSI_D0_N, DSI_D0_P, DSI_D1_N, DSI_D1_P, USBD_N, USBD_P

### Library data of the parts
C?#27-C?#67 = cap_0402_VJ0402D100MXCAP: cap 0402; MF: Vishay Vitramon; SnapEDA_Link: https://www.snapeda.com/parts/VJ0402D100MXCAP/Vishay/view-part/?ref=snap; Package: 1005 Vishay Vitramon; Value: *; MP: VJ0402D100MXCAP; Check_prices: https://www.snapeda.com/parts/VJ0402D100MXCAP/Vishay/view-part/?ref=eda
L?#2 = CIGT201610EH1R0MNE: RF Inductors - SMD CIGT,Thin Film,0806,1.0uH,1.0?,7 embossed,-20 20%; Manufacturer_Name: SAMSUNG; Geometry.Height: 1mm; Manufacturer_Part_Number: CIGT201610EH1R0MNE; Mouser Part Number: 187-CIGT201610EH1R0M; Mouser Price/Stock: https://www.mouser.co.uk/ProductDetail/Samsung-Electro-Mechanics/CIGT201610EH1R0MNE?qs=xZ%2FP%252Ba9zWqaBrqhkAlUALQ%3D%3D; Arrow Part Number: CIGT201610EH1R0MNE; Arrow Price/Stock: https://www.arrow.com/en/products/cigt201610eh1r0mne/samsung-electro-mechanics?region=nac; Datasheet Link: https://www.mouser.com/ProductDetail/Samsung-Electro-Mechanics/CIGT201610EH1R0MNE?qs=xZ%2FP%252Ba9zWqaBrqhkAlUALQ%3D%3D&utm_id=22030780983&gad_source=1&gclid=EAIaIQobChMIvLSdy--WiwMVck1HAR1lcz2jEAAYAyAAEgL_IvD_BwE
R?#37-R?#46 = res_0402_ERJU02F5102X: Availability: Unavailable; MP: ERJU02F5102X; Price: None; Package: None; Value: *
U?#8 = MP1605GTF-Z: 2A 5.5V 2.2MHz Synchronous Step-Down Converter with Low11&micro;A Quiescent Current in SOT563 Package; Manufacturer_Name: Monolithic Power Systems; Copyright: Copyright (C) 2025 Ultra Librarian. All rights reserved.; Manufacturer_Part_Number: MP1605GTF-Z; RefDes: RefDes; Type: Type
U?#9 = ESP32-P4NRW32X: Manufacturer: Espressif Systems; Value: ESP32-P4NRW32X; MPN: ESP32-P4NRW32X; Mouser Part #: 356-ESP32-P4NRW32X; DigiKey Part #: 1965-ESP32-P4NRW32XTR-ND; Manufacturer Part Number: ESP32-P4NRW32X
U?#10 = GD25Q128ESIGR: Manufacturer: GigaDevice Semicon Beijing; Value: GD25Q128ESIGR; MPN: GD25Q128ESIGR; LCSC Part #: C2928891; Manufacturer Part Number: GD25Q128ESIGR
Y?#2 = TSX-3225_40.0000MF10Y-W6: 40 MHz Â±10ppm Crystal 12pF 40 Ohms 4-SMD, No Lead; MP: TSX-3225 40.0000MF10Y-W6; MF: EPSON; Check_prices: https://www.snapeda.com/parts/TSX-3225%2040.0000MF10Y-W6/EPSON/view-part/?ref=eda; Price: None; Purchase-URL: https://pricing.snapeda.com/search/part/TSX-3225 40.0000MF10Y-W6/?ref=eda; SnapEDA_Link: https://www.snapeda.com/parts/TSX-3225%2040.0000MF10Y-W6/EPSON/view-part/?ref=snap; Availability: In Stock; Package: NON STANDARD-4 EPSON; Value: *
Y?#3 = ABS07-32.768KHZ-T: as Y?#1 on sheet esp32c5; Availability: In Stock; SnapEDA_Link: https://www.snapeda.com/parts/ABS07-32.768KHZ-T/Abracon+LLC/view-part/?ref=snap; MP: ABS07-32.768KHZ-T; Price: None; Value: *; Check_prices: https://www.snapeda.com/parts/ABS07-32.768KHZ-T/Abracon+LLC/view-part/?ref=eda; Purchase-URL: https://pricing.snapeda.com/search/part/ABS07-32.768KHZ-T/?ref=eda; Package: SMD-2 Abracon LLC

## Sheet connect.SchDoc
size B; SheetNumber: 6; SheetTotal: 6
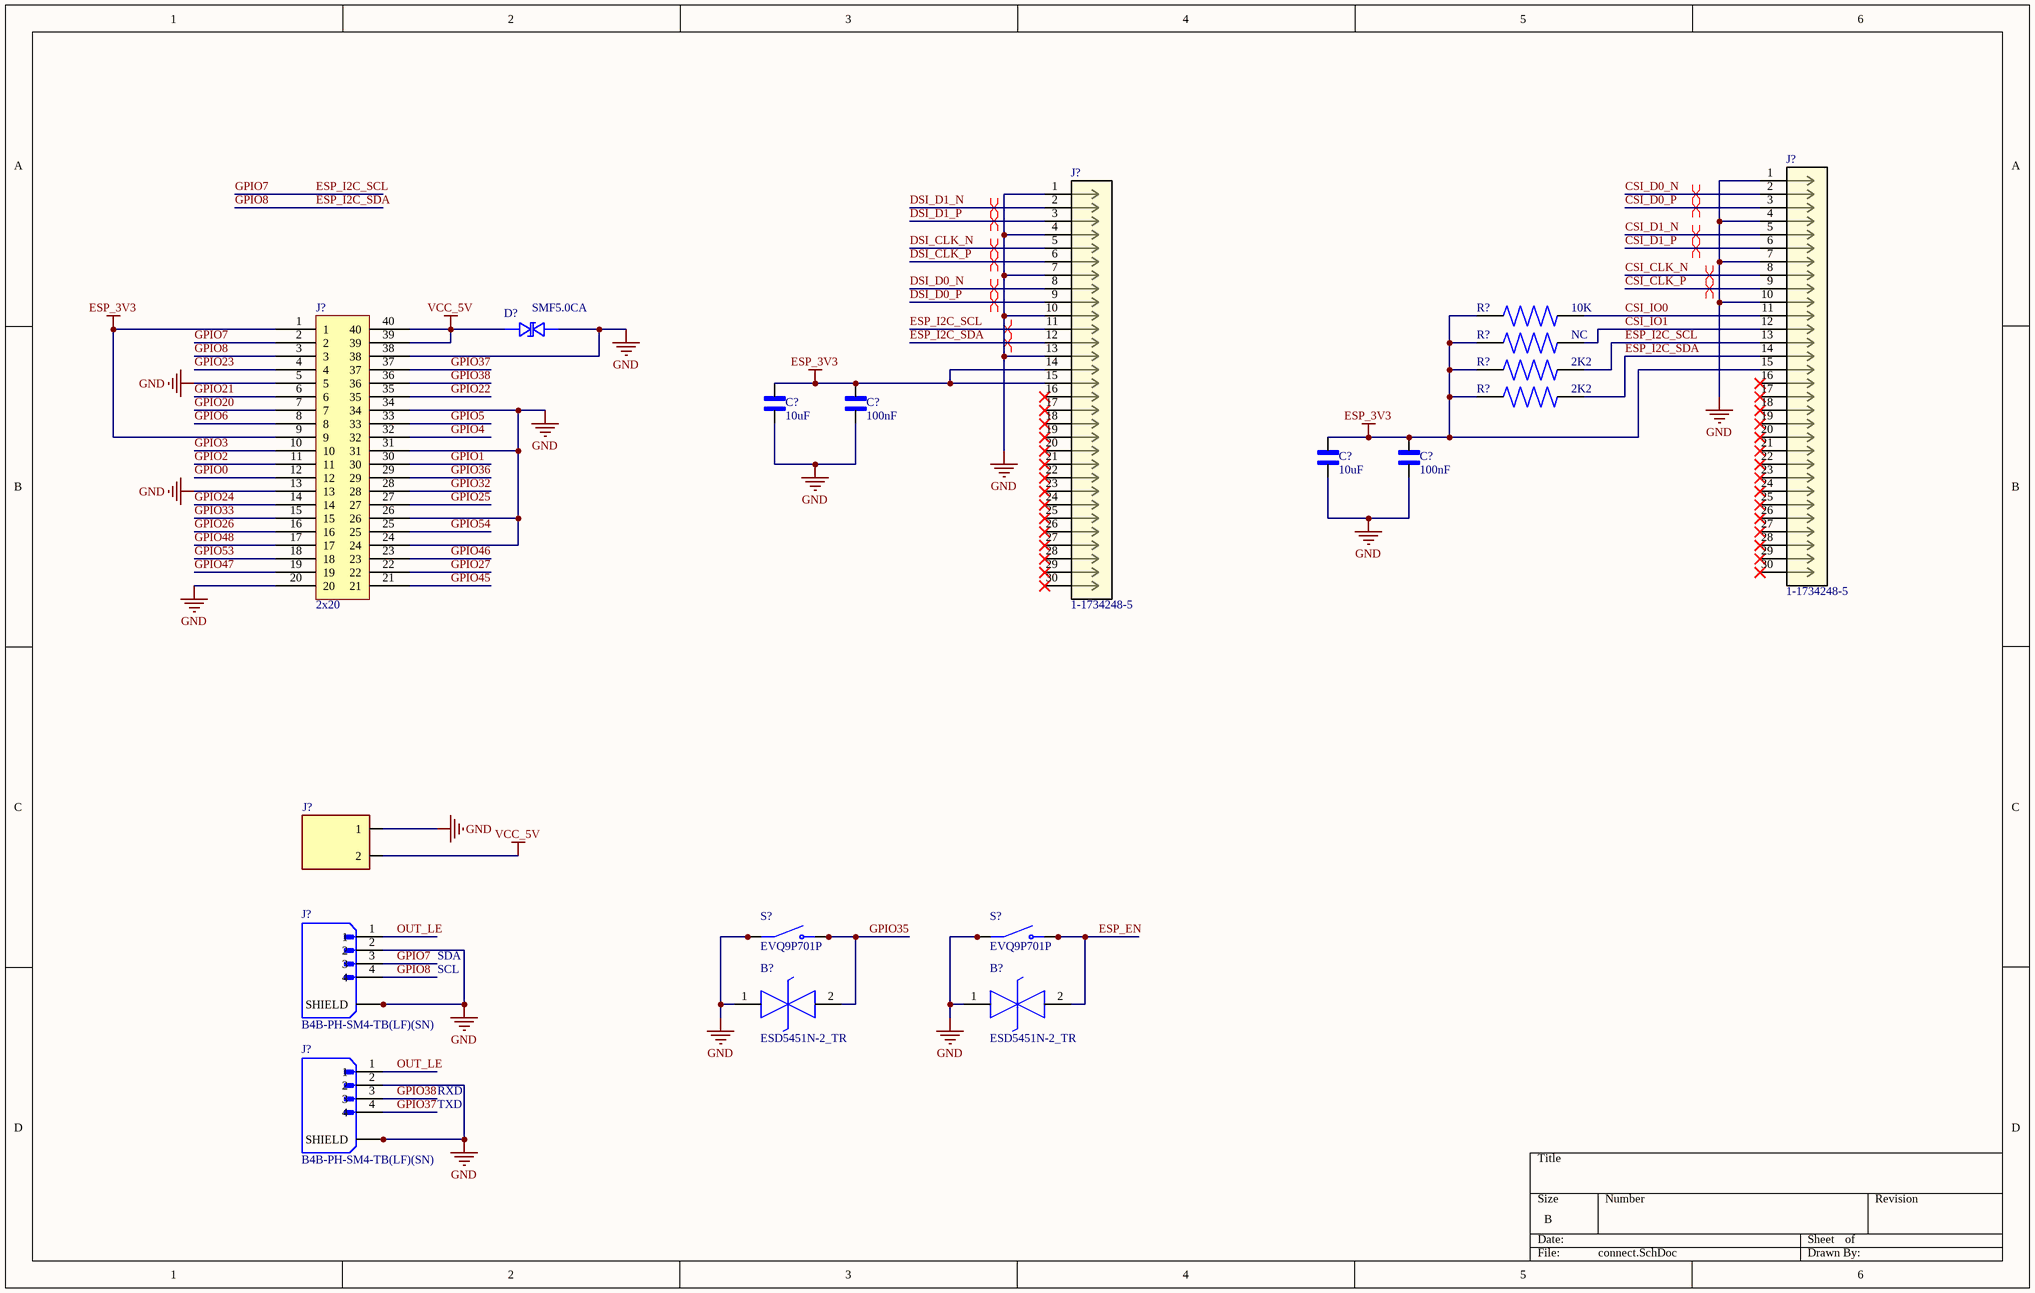
[diagram p5: connect.SchDoc]

### Parts
(Parts that share a designator on the sheet are numbered #1, #2 ... from top to bottom, then left to right.)
B?#2  ESD5451N-2_TR  [ESD5451N2TR]
B?#3  ESD5451N-2_TR  [ESD5451N2TR]
C?#68  10uF  [CAPC1005X61N]
C?#69  100nF  [CAPC1005X61N]
C?#70  10uF  [CAPC1005X61N]
C?#71  100nF  [CAPC1005X61N]
D?#5  SMF5.0CA  [SOD-123FL]
J?#7  1-1734248-5  [conn30_1-1734248-5_TEC]
J?#8  1-1734248-5  [conn30_1-1734248-5_TEC]
J?#9  2x20  [2x40]
J?#10  B2B-PH-SM4-TB(LF)(SN)  [SM4-CON]  (value not drawn)
J?#11  B4B-PH-SM4-TB(LF)(SN)  [JST_B4B-PH-SM4-TB(LF)(SN)]
J?#12  B4B-PH-SM4-TB(LF)(SN)  [JST_B4B-PH-SM4-TB(LF)(SN)]
R?#47  10K  [RES_ERJU02F5102X]
R?#48  NC  [RES_ERJU02F5102X]
R?#49  2K2  [RES_ERJU02F5102X]
R?#50  2K2  [RES_ERJU02F5102X]
S?#1  EVQ9P701P  [SW_EVQ9P701P]
S?#2  EVQ9P701P  [SW_EVQ9P701P]

### Nets
ESP_3V3: C?#68.1 C?#69.1 C?#70.1 C?#71.1 J?#7.15 J?#8.14 J?#8.15 J?#9.1 J?#9.9 R?#47.2 R?#48.2 R?#49.2 R?#50.2
GND: B?#2.1(K1) B?#3.1(K1) C?#68.2 C?#69.2 C?#70.2 C?#71.2 D?#5.P$2 J?#7.1 J?#7.4 J?#7.7 J?#7.10 J?#8.1 J?#8.4 J?#8.7 J?#8.10 J?#8.13 J?#9.5 J?#9.13 J?#9.20 J?#9.24 J?#9.26 J?#9.31 J?#9.34 J?#9.38 J?#10.1 J?#11.2 J?#11.SH1(SHIELD) J?#11.SH2(SHIELD) J?#12.2 J?#12.SH1(SHIELD) J?#12.SH2(SHIELD) S?#1.2_A(NC) S?#1.2_B(NC) S?#2.2_A(NC) S?#2.2_B(NC)
VCC_5V: D?#5.P$1 J?#9.39 J?#9.40 J?#10.2
CSI_CLK_N: J?#7.8
CSI_CLK_P: J?#7.9
CSI_D0_N: J?#7.2
CSI_D0_P: J?#7.3
CSI_D1_N: J?#7.5
CSI_D1_P: J?#7.6
CSI_IO0: J?#7.11 R?#47.1
CSI_IO1: J?#7.12 R?#48.1
DSI_CLK_N: J?#8.5
DSI_CLK_P: J?#8.6
DSI_D0_N: J?#8.8
DSI_D0_P: J?#8.9
DSI_D1_N: J?#8.2
DSI_D1_P: J?#8.3
ESP_EN: B?#3.2(K2) S?#2.1_A(NO) S?#2.1_B(NO)
ESP_I2C_SCL: J?#7.13 J?#8.11 J?#9.2 J?#11.3 R?#49.1  [also labelled GPIO7]
ESP_I2C_SDA: J?#7.14 J?#8.12 J?#9.3 J?#11.4 R?#50.1  [also labelled GPIO8]
GPIO0: J?#9.12
GPIO1: J?#9.30
GPIO2: J?#9.11
GPIO3: J?#9.10
GPIO4: J?#9.32
GPIO5: J?#9.33
GPIO6: J?#9.8
GPIO20: J?#9.7
GPIO21: J?#9.6
GPIO22: J?#9.35
GPIO23: J?#9.4
GPIO24: J?#9.14
GPIO25: J?#9.27
GPIO26: J?#9.16
GPIO27: J?#9.22
GPIO32: J?#9.28
GPIO33: J?#9.15
GPIO35: B?#2.2(K2) S?#1.1_A(NO) S?#1.1_B(NO)
GPIO36: J?#9.29
GPIO37: J?#9.37 J?#12.4
GPIO38: J?#9.36 J?#12.3
GPIO45: J?#9.21
GPIO46: J?#9.23
GPIO47: J?#9.19
GPIO48: J?#9.17
GPIO53: J?#9.18
GPIO54: J?#9.25
OUT_LE: J?#11.1 J?#12.1

Not connected (* = marked no-connect by the designer): J?#7 16* 17* 18* 19* 20* 21* 22* 23* 24* 25* 26* 27* 28* 29* 30*; J?#8 16* 17* 18* 19* 20* 21* 22* 23* 24* 25* 26* 27* 28* 29* 30*

### Layout directives
differential pair: CSI_CLK_N, CSI_CLK_P, CSI_D0_N, CSI_D0_P, CSI_D1_N, CSI_D1_P, DSI_CLK_N, DSI_CLK_P, DSI_D0_N, DSI_D0_P, DSI_D1_N, DSI_D1_P, ESP_I2C_SCL, ESP_I2C_SDA

### Notes on the sheet
- SDA
- SCL
- RXD
- TXD

### Library data of the parts
B?#2 B?#3 = ESD5451N-2_TR: 1-Line, Bi-directional, Transient Voltage Suppressors; Manufacturer_Name: Will Semiconductor; Manufacturer_Part_Number: ESD5451N-2/TR; Geometry.Height: 0.53mm; Mouser Part Number: *; Mouser Price/Stock: *; Arrow Part Number: *; Arrow Price/Stock: *; Datasheet Link: https://lcsc.com/datasheet/lcsc_datasheet_2410121433_WILLSEMI-Will-Semicon-ESD5451N-2-TR_C239604.pdf
C?#68-C?#71 = cap_0402_VJ0402D100MXCAP: cap 0402; MF: Vishay Vitramon; SnapEDA_Link: https://www.snapeda.com/parts/VJ0402D100MXCAP/Vishay/view-part/?ref=snap; Package: 1005 Vishay Vitramon; Value: *; MP: VJ0402D100MXCAP; Check_prices: https://www.snapeda.com/parts/VJ0402D100MXCAP/Vishay/view-part/?ref=eda
D?#5 = SMF5.0CA: 9.2V Clamp 21.7A Ipp Tvs Diode Surface Mount SOD-123F; MF: Littelfuse Inc.; SnapEDA_Link: https://www.snapeda.com/parts/SMF5.0CA/Littelfuse/view-part/?ref=snap; Package: SOD-123F Littelfuse; Value: *; MP: SMF5.0CA; Check_prices: https://www.snapeda.com/parts/SMF5.0CA/Littelfuse/view-part/?ref=eda
J?#7 J?#8 = 1-1734248-5: 1.0 FPC, ZIF V/T, SMT, 15P; Manufacturer_Name: TE Connectivity; TYPE: Receptacle; Copyright: Copyright (C) 2026 Ultra Librarian. All rights reserved.; Manufacturer_Part_Number: 1-1734248-5; RefDes: RefDes
J?#9 = 2x20: 40-pin dual-row male header, 2×20 configuration, 2.54mm pitch, through-hole mounting
J?#10 = B2B-PH-SM4-TB(LF)(SN): as RTC_BAT on sheet usb_uart_ESP32P4; SnapEDA_Link: https://www.snapeda.com/parts/B2B-PH-SM4-TB(LF)(SN)/JST+Sales+America+Inc./view-part/?ref=snap; Package: NON STANDARD-2 JST; Value: *; MP: B2B-PH-SM4-TB(LF)(SN); Check_prices: https://www.snapeda.com/parts/B2B-PH-SM4-TB(LF)(SN)/JST+Sales+America+Inc./view-part/?ref=eda
J?#11 J?#12 = B4B-PH-SM4-TB(LF)(SN): Connector Header Surface Mount 4 position 0.079 (2.00mm); MF: JST Sales; SnapEDA_Link: https://www.snapeda.com/parts/B4B-PH-SM4-TB(LF)(SN)/JST+Sales+America+Inc./view-part/?ref=snap; Package: NON STANDARD-4 JST; Value: *; MP: B4B-PH-SM4-TB(LF)(SN); Check_prices: https://www.snapeda.com/parts/B4B-PH-SM4-TB(LF)(SN)/JST+Sales+America+Inc./view-part/?ref=eda
R?#47-R?#50 = res_0402_ERJU02F5102X: Availability: Unavailable; MP: ERJU02F5102X; Price: None; Package: None; Value: *
S?#1 S?#2 = EVQ9P701P: MF: {'manufacturer': u'Panasonic Electronic Components'}; Package: None; Price: None; Value: *; MP: EVQ9P701P; Availability: Unavailable

## Sheet usb_uart_esp32c5.SchDoc
size A; SheetNumber: 7; SheetTotal: 7
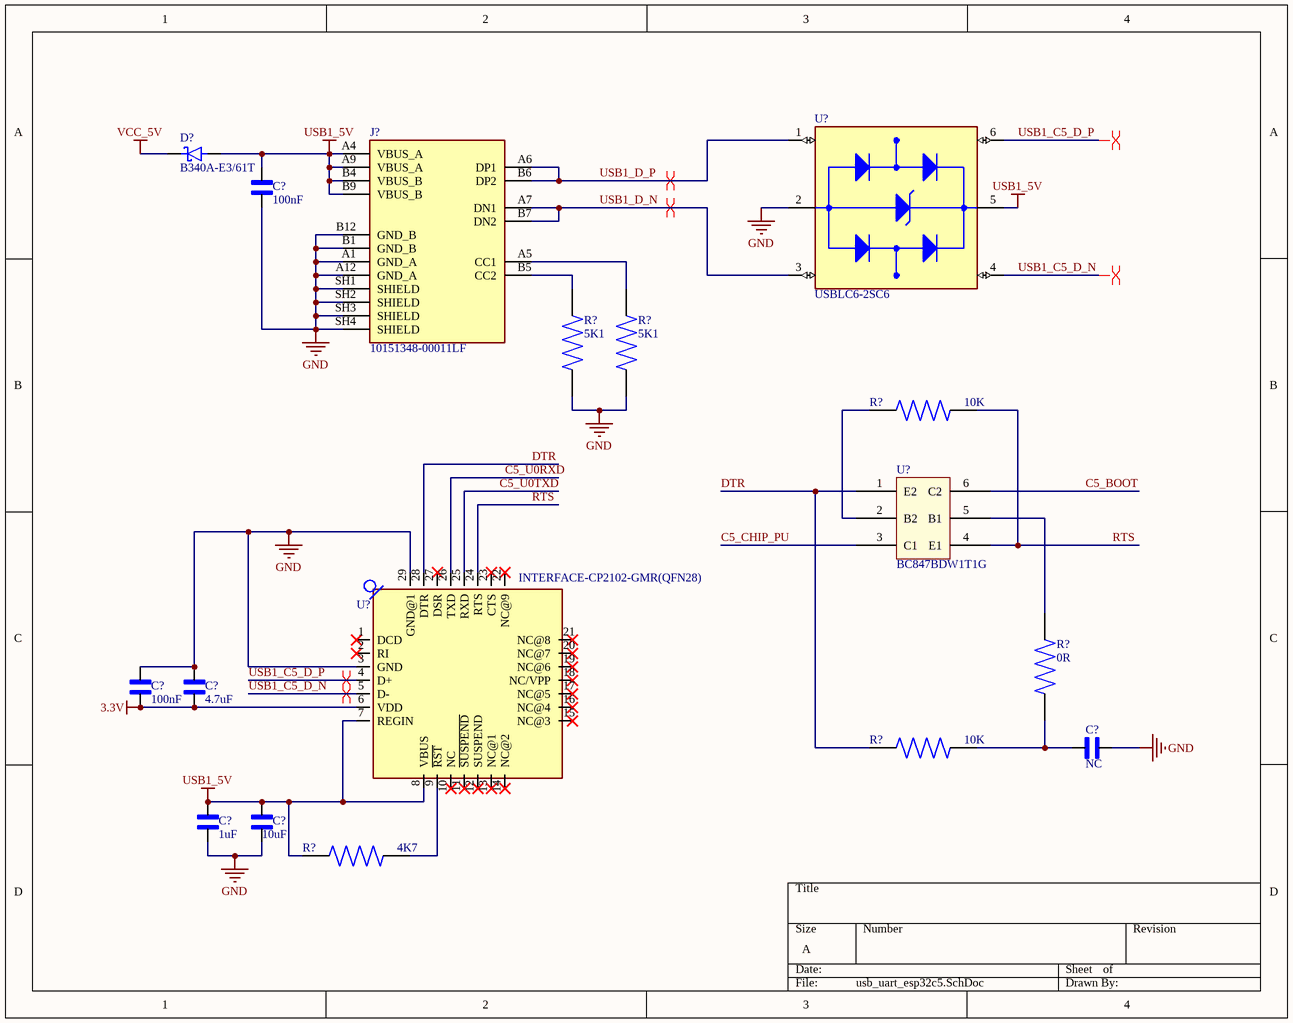
[diagram p6: usb_uart_esp32c5.SchDoc]

### Parts
(Parts that share a designator on the sheet are numbered #1, #2 ... from top to bottom, then left to right.)
C?#72  100nF  [CAPC1608X94N]
C?#73  100nF  [CAPC1608X94N]
C?#74  4.7uF  [CAPC1608X94N]
C?#75  NC  [CAPC1608X94N]
C?#76  1uF  [CAPC1608X94N]
C?#77  10uF  [CAPC1608X94N]
D?#6  B340A-E3/61T  [DIOM5126X229N]
J?#13  10151348-00011LF  [AMPHENOL_10151348-00011LF]
R?#51  5K1  [RES_ERJU02F5102X]
R?#52  5K1  [RES_ERJU02F5102X]
R?#53  10K  [RES_ERJU02F5102X]
R?#54  0R  [RES_ERJU02F5102X]
R?#55  10K  [RES_ERJU02F5102X]
R?#56  4K7  [RES_ERJU02F5102X]
U?#11  USBLC6-2SC6  [USBLC6-2SC6]
U?#12  BC847BDW1T1G  [SOT65P210X110-6N]
U?#13  INTERFACE-CP2102-GMR(QFN28)  [QFN28G_0.5-5X5MM]

### Nets
3.3V: C?#73.1 C?#74.1 U?#13.6(VDD)
GND: C?#72.1 C?#73.2 C?#74.2 C?#75.1 C?#76.2 C?#77.2 J?#13.A1(GND_A) J?#13.A12(GND_A) J?#13.B1(GND_B) J?#13.B12(GND_B) J?#13.SH1(SHIELD) J?#13.SH2(SHIELD) J?#13.SH3(SHIELD) J?#13.SH4(SHIELD) R?#51.1 R?#52.1 U?#11.2(GND) U?#13.3(GND) U?#13.29(GND@1)
USB1_5V: C?#72.2 C?#76.1 C?#77.1 D?#6.A J?#13.A4(VBUS_A) J?#13.A9(VBUS_A) J?#13.B4(VBUS_B) J?#13.B9(VBUS_B) R?#56.2 U?#11.5(VBUS) U?#13.7(REGIN) U?#13.8(VBUS)
VCC_5V: D?#6.C
C5_BOOT: U?#12.6(C2)
C5_CHIP_PU: U?#12.3(C1)
C5_U0RXD: U?#13.26(TXD)
C5_U0TXD: U?#13.25(RXD)
DTR: R?#55.2 U?#12.1(E2) U?#13.28(DTR)
RTS: R?#53.1 U?#12.4(E1) U?#13.24(RTS)
USB1_C5_D_N: U?#11.4(I/O2_OUT) U?#13.5(D-)
USB1_C5_D_P: U?#11.6(I/O1_OUT) U?#13.4(D+)
USB1_D_N: J?#13.A7(DN1) J?#13.B7(DN2) U?#11.3(I/O2_IN)
USB1_D_P: J?#13.A6(DP1) J?#13.B6(DP2) U?#11.1(I/O1_IN)
NetC?#75_2: C?#75.2 R?#54.2 R?#55.1
NetJ?#13_A5: J?#13.A5(CC1) R?#52.2
NetJ?#13_B5: J?#13.B5(CC2) R?#51.2
NetR?#53_2: R?#53.2 U?#12.2(B2)
NetR?#54_1: R?#54.1 U?#12.5(B1)
NetR?#56_1: R?#56.1 U?#13.9(~{RST})

Not connected (* = marked no-connect by the designer): U?#13 1(DCD)* 2(RI)* 10(NC)* 11(~{SUSPEND})* 12(SUSPEND)* 13(NC@1)* 14(NC@2)* 15(NC@3)* 16(NC@4)* 17(NC@5)* 18(NC/VPP)* 19(NC@6)* 20(NC@7)* 21(NC@8)* 22(NC@9)* 23(CTS)* 27(DSR)*

### Layout directives
differential pair: USB1_C5_D_N, USB1_C5_D_P, USB1_D_N, USB1_D_P

### Library data of the parts
C?#72-C?#77 = cap_0603_VJ0603D3R9DXCAP: cap 0603 (1608 Metric); MF: Vishay Vitramon; SnapEDA_Link: https://www.snapeda.com/parts/VJ0603D3R9DXCAP/Vishay/view-part/?ref=snap; Package: 1608 Vishay Vitramon; Value: *; MP: VJ0603D3R9DXCAP; Check_prices: https://www.snapeda.com/parts/VJ0603D3R9DXCAP/Vishay/view-part/?ref=eda
D?#6 = B340A-E3/61T: Diode Schottky 40 V 3A Surface Mount DO-214AC (SMA); MF: Vishay Semiconductor; SnapEDA_Link: https://www.snapeda.com/parts/B340A-E3/61T/Vishay/view-part/?ref=snap; Package: DO-214 Vishay Semiconductor; Value: *; MP: B340A-E3/61T; Check_prices: https://www.snapeda.com/parts/B340A-E3/61T/Vishay/view-part/?ref=eda
J?#13 = 10151348-00011LF: USB Type C Receptacle T/H 14Pin Upright; MF: Amphenol ICC (FCI); SnapEDA_Link: https://www.snapeda.com/parts/10151348-00011LF/Amphenol+ICC/view-part/?ref=snap; Package: None; Value: *; MP: 10151348-00011LF; Check_prices: https://www.snapeda.com/parts/10151348-00011LF/Amphenol+ICC/view-part/?ref=eda
R?#51-R?#56 = res_0402_ERJU02F5102X: Availability: Unavailable; MP: ERJU02F5102X; Price: None; Package: None; Value: *
U?#11 = USBLC6-2SC6: 17V Clamp 5A (8/20Âµs) Ipp Tvs Diode Surface Mount SOT-23-6; MF: STMicroelectronics; Value: *; SnapEDA_Link: https://www.snapeda.com/parts/USBLC6-2SC6/STMicroelectronics/view-part/?ref=snap; Check_prices: https://www.snapeda.com/parts/USBLC6-2SC6/STMicroelectronics/view-part/?ref=eda; Purchase-URL: https://pricing.snapeda.com/search/part/USBLC6-2SC6/?ref=eda; Price: None; Availability: In Stock; Package: SOT-23-6 STMicroelectronics; MP: USBLC6-2SC6
U?#12 = BC847BDW1T1G: Bipolar (BJT) Transistor Array 2 NPN (Dual) 45V 100mA 100MHz 380mW Surface Mount SC-88/SC70-6/SOT-363; MF: onsemi; SnapEDA_Link: https://www.snapeda.com/parts/BC847BDW1T1G/Onsemi/view-part/?ref=snap; Package: SC-88-6 ON Semiconductor; Value: *; MP: BC847BDW1T1G; Check_prices: https://www.snapeda.com/parts/BC847BDW1T1G/Onsemi/view-part/?ref=eda
U?#13 = INTERFACE-CP2102-GMR(QFN28): USB Bridge, USB to UART USB 2.0 UART Interface 28-QFN (5x5); MF: Silicon; Price: None; Availability: In Stock; MP: CP2102-GMR; Package: VFQFN-28 Vishay Siliconix; SnapEDA_Link: https://www.snapeda.com/parts/CP2102-GMR/Silicon+Labs/view-part/?ref=snap; Check_prices: https://www.snapeda.com/parts/CP2102-GMR/Silicon+Labs/view-part/?ref=eda; Value: *; Purchase-URL: https://pricing.snapeda.com/search/part/CP2102-GMR/?ref=eda

## Nets that join several sheets
ESP_3V3: esp32c5 (12 pins), MSD_CARD (R?#18.1 U?#2.2), type_C_A_power (6 pins), usb_uart_ESP32P4 (10 pins), ESP32_P4 (23 pins), connect (13 pins)
ESP_LDO_VO4: MSD_CARD (5 pins), ESP32_P4 (5 pins)
ESP_VBAT: usb_uart_ESP32P4 (J?#5.1 J?#6.1), ESP32_P4 (C?#39.1 C?#40.1 U?#9.102)
GND: esp32c5 (36 pins), MSD_CARD (8 pins), type_C_A_power (35 pins), usb_uart_ESP32P4 (10 pins), ESP32_P4 (48 pins), connect (35 pins), usb_uart_esp32c5 (19 pins)
USB0_5V: type_C_A_power (9 pins), usb_uart_ESP32P4 (C?#23.2 U?#6.9)
VCC_5V: type_C_A_power (13 pins), connect (D?#5.P$1 J?#9.39 J?#9.40 J?#10.2), usb_uart_esp32c5 (D?#6.C)
C5_BOOT: esp32c5 (R?#10.1 U?#1.4), usb_uart_esp32c5 (U?#12.6)
C5_CHIP_PU: esp32c5 (C?#1.1 R?#1.2 R?#12.2 U?#1.45), usb_uart_esp32c5 (U?#12.3)
C5_U0RXD: esp32c5 (U?#1.40), usb_uart_esp32c5 (U?#13.26)
C5_U0TXD: esp32c5 (U?#1.39), usb_uart_esp32c5 (U?#13.25)
CSI_CLK_N: ESP32_P4 (U?#9.45), connect (J?#7.8)
CSI_CLK_P: ESP32_P4 (U?#9.44), connect (J?#7.9)
CSI_D0_N: ESP32_P4 (U?#9.42), connect (J?#7.2)
CSI_D0_P: ESP32_P4 (U?#9.43), connect (J?#7.3)
CSI_D1_N: ESP32_P4 (U?#9.46), connect (J?#7.5)
CSI_D1_P: ESP32_P4 (U?#9.47), connect (J?#7.6)
DSI_CLK_N: ESP32_P4 (U?#9.38), connect (J?#8.5)
DSI_CLK_P: ESP32_P4 (U?#9.37), connect (J?#8.6)
DSI_D0_N: ESP32_P4 (U?#9.40), connect (J?#8.8)
DSI_D0_P: ESP32_P4 (U?#9.39), connect (J?#8.9)
DSI_D1_N: ESP32_P4 (U?#9.36), connect (J?#8.2)
DSI_D1_P: ESP32_P4 (U?#9.35), connect (J?#8.3)
DTR: usb_uart_ESP32P4 (U?#6.12 U?#7.2 U?#7.4), usb_uart_esp32c5 (R?#55.2 U?#12.1 U?#13.28)
ESP_EN: usb_uart_ESP32P4 (C?#25.2 R?#35.1 U?#7.6), ESP32_P4 (U?#9.103), connect (B?#3.2 S?#2.1_A S?#2.1_B)
ESP_I2C_SCL: ESP32_P4 (U?#9.7), connect (5 pins)
ESP_I2C_SDA: ESP32_P4 (U?#9.8), connect (5 pins)
GPIO0: ESP32_P4 (C?#27.2 R?#38.2 U?#9.104 Y?#3.2), connect (J?#9.12)
GPIO1: ESP32_P4 (C?#33.2 R?#38.1 U?#9.1 Y?#3.1), connect (J?#9.30)
GPIO2: ESP32_P4 (U?#9.2), connect (J?#9.11)
GPIO3: ESP32_P4 (U?#9.3), connect (J?#9.10)
GPIO4: ESP32_P4 (U?#9.4), connect (J?#9.32)
GPIO5: ESP32_P4 (U?#9.5), connect (J?#9.33)
GPIO6: esp32c5 (R?#11.1), ESP32_P4 (U?#9.6), connect (J?#9.8)
GPIO14: esp32c5 (R?#7.2 U?#1.20), ESP32_P4 (U?#9.15)
GPIO15: esp32c5 (R?#6.2 U?#1.19), ESP32_P4 (U?#9.16)
GPIO16: esp32c5 (R?#4.1 U?#1.24), ESP32_P4 (U?#9.17)
GPIO17: esp32c5 (R?#3.1 U?#1.23), ESP32_P4 (U?#9.18)
GPIO18: esp32c5 (R?#9.2 U?#1.21), ESP32_P4 (U?#9.19)
GPIO19: esp32c5 (R?#2.1 U?#1.22), ESP32_P4 (U?#9.20)
GPIO20: ESP32_P4 (U?#9.22), connect (J?#9.7)
GPIO21: ESP32_P4 (U?#9.23), connect (J?#9.6)
GPIO22: ESP32_P4 (U?#9.24), connect (J?#9.35)
GPIO23: ESP32_P4 (U?#9.25), connect (J?#9.4)
GPIO24: ESP32_P4 (U?#9.52), connect (J?#9.14)
GPIO25: ESP32_P4 (U?#9.53), connect (J?#9.27)
GPIO26: ESP32_P4 (U?#9.55), connect (J?#9.16)
GPIO27: ESP32_P4 (U?#9.56), connect (J?#9.22)
GPIO32: ESP32_P4 (U?#9.63), connect (J?#9.28)
GPIO33: ESP32_P4 (U?#9.64), connect (J?#9.15)
GPIO35: usb_uart_ESP32P4 (C?#26.1 R?#36.2 U?#7.3), ESP32_P4 (U?#9.66), connect (B?#2.2 S?#1.1_A S?#1.1_B)
GPIO36: ESP32_P4 (R?#41.2 U?#9.68), connect (J?#9.29)
GPIO37: usb_uart_ESP32P4 (U?#6.5), ESP32_P4 (U?#9.69), connect (J?#9.37 J?#12.4)
GPIO38: usb_uart_ESP32P4 (U?#6.4), ESP32_P4 (U?#9.70), connect (J?#9.36 J?#12.3)
GPIO39: MSD_CARD (J?#1.7 R?#14.1), ESP32_P4 (U?#9.80)
GPIO40: MSD_CARD (J?#1.8 R?#15.1), ESP32_P4 (U?#9.81)
GPIO41: MSD_CARD (J?#1.1 R?#16.1), ESP32_P4 (U?#9.82)
GPIO42: MSD_CARD (J?#1.2 R?#17.1), ESP32_P4 (U?#9.83)
GPIO43: MSD_CARD (J?#1.5), ESP32_P4 (U?#9.84)
GPIO44: MSD_CARD (J?#1.3 R?#13.1), ESP32_P4 (U?#9.86)
GPIO45: MSD_CARD (R?#18.2 R?#19.2 U?#2.1), ESP32_P4 (U?#9.87), connect (J?#9.21)
GPIO46: ESP32_P4 (U?#9.88), connect (J?#9.23)
GPIO47: ESP32_P4 (U?#9.89), connect (J?#9.19)
GPIO48: ESP32_P4 (U?#9.90), connect (J?#9.17)
GPIO53: ESP32_P4 (U?#9.97), connect (J?#9.18)
GPIO54: esp32c5 (R?#12.1), ESP32_P4 (U?#9.98), connect (J?#9.25)
RTS: usb_uart_ESP32P4 (U?#6.13 U?#7.1 U?#7.5), usb_uart_esp32c5 (R?#53.1 U?#12.4 U?#13.24)
USB_DBG_D_N: type_C_A_power (D?#2.2 J?#2.A7 J?#2.B7), usb_uart_ESP32P4 (U?#6.8)
USB_DBG_D_P: type_C_A_power (D?#1.2 J?#2.A6 J?#2.B6), usb_uart_ESP32P4 (U?#6.7)
USBD_N: type_C_A_power (D?#4.1 J?#2.C2), ESP32_P4 (U?#9.49)
USBD_P: type_C_A_power (D?#3.1 J?#2.C3), ESP32_P4 (U?#9.50)